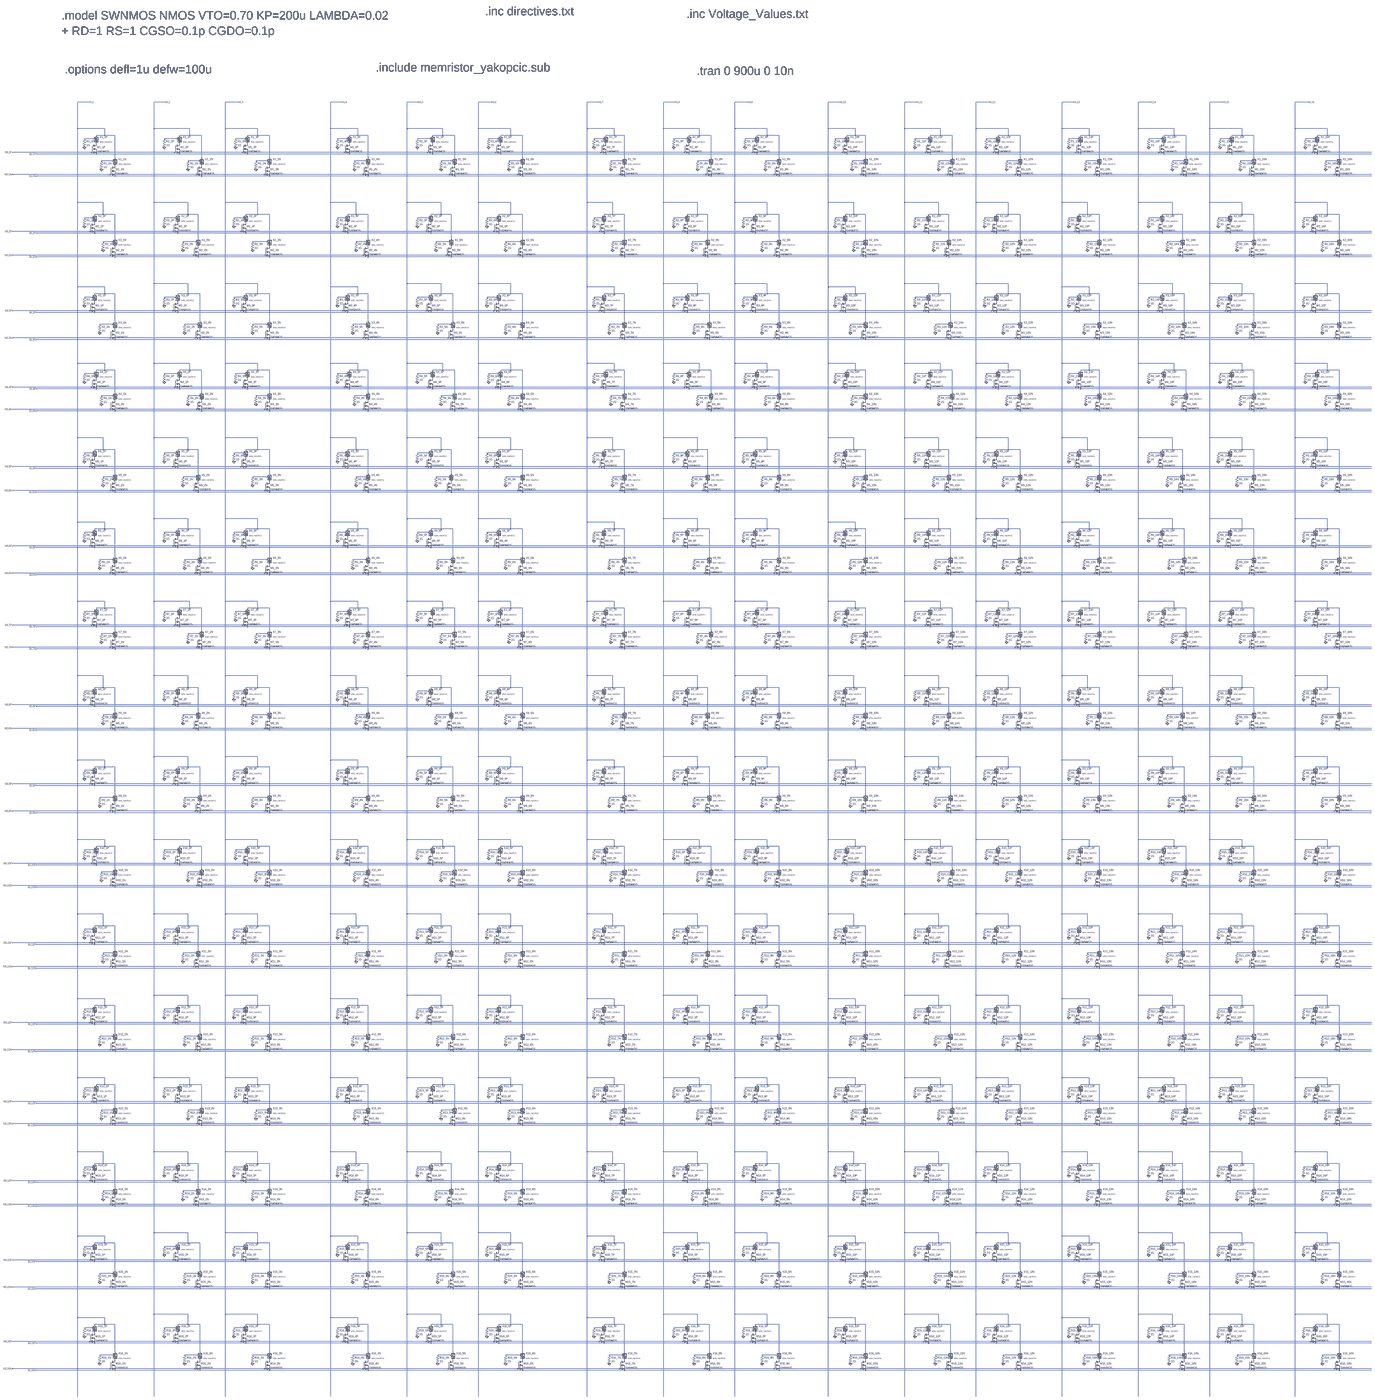
[diagram p0: schematic Trenery-2T2R.asc, whole sheet]
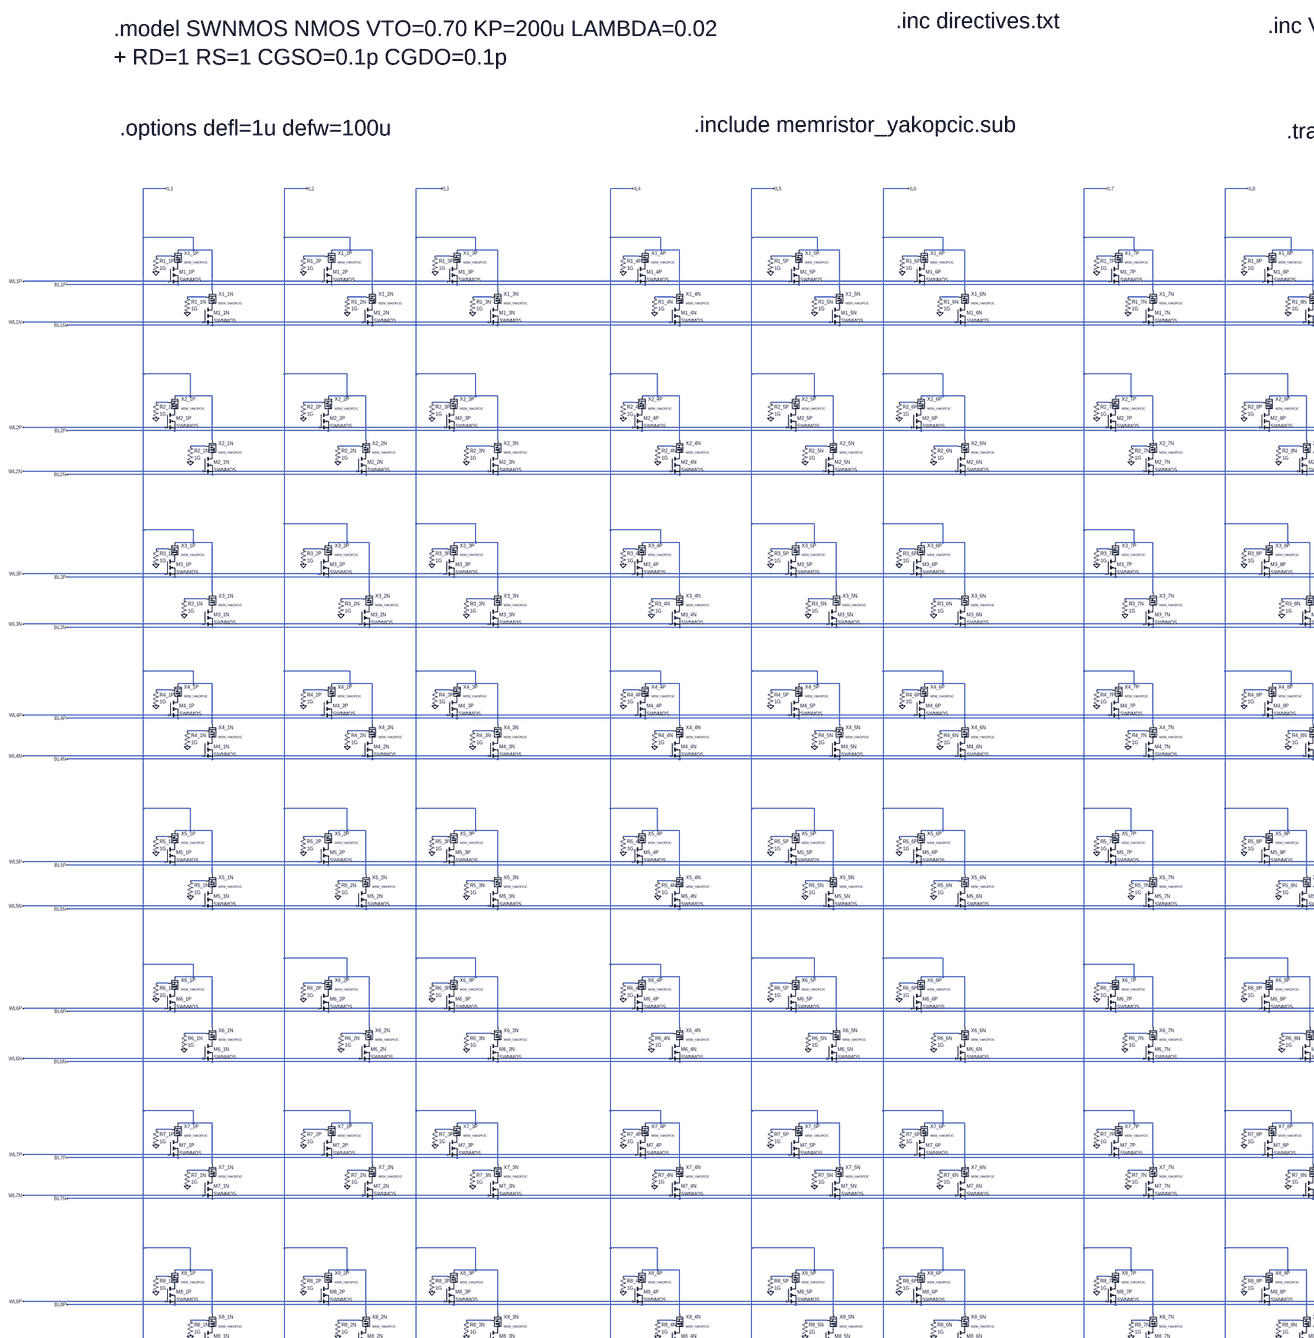
[diagram p1: schematic Trenery-2T2R.asc, part, row 1 of 2, column 1 of 2]
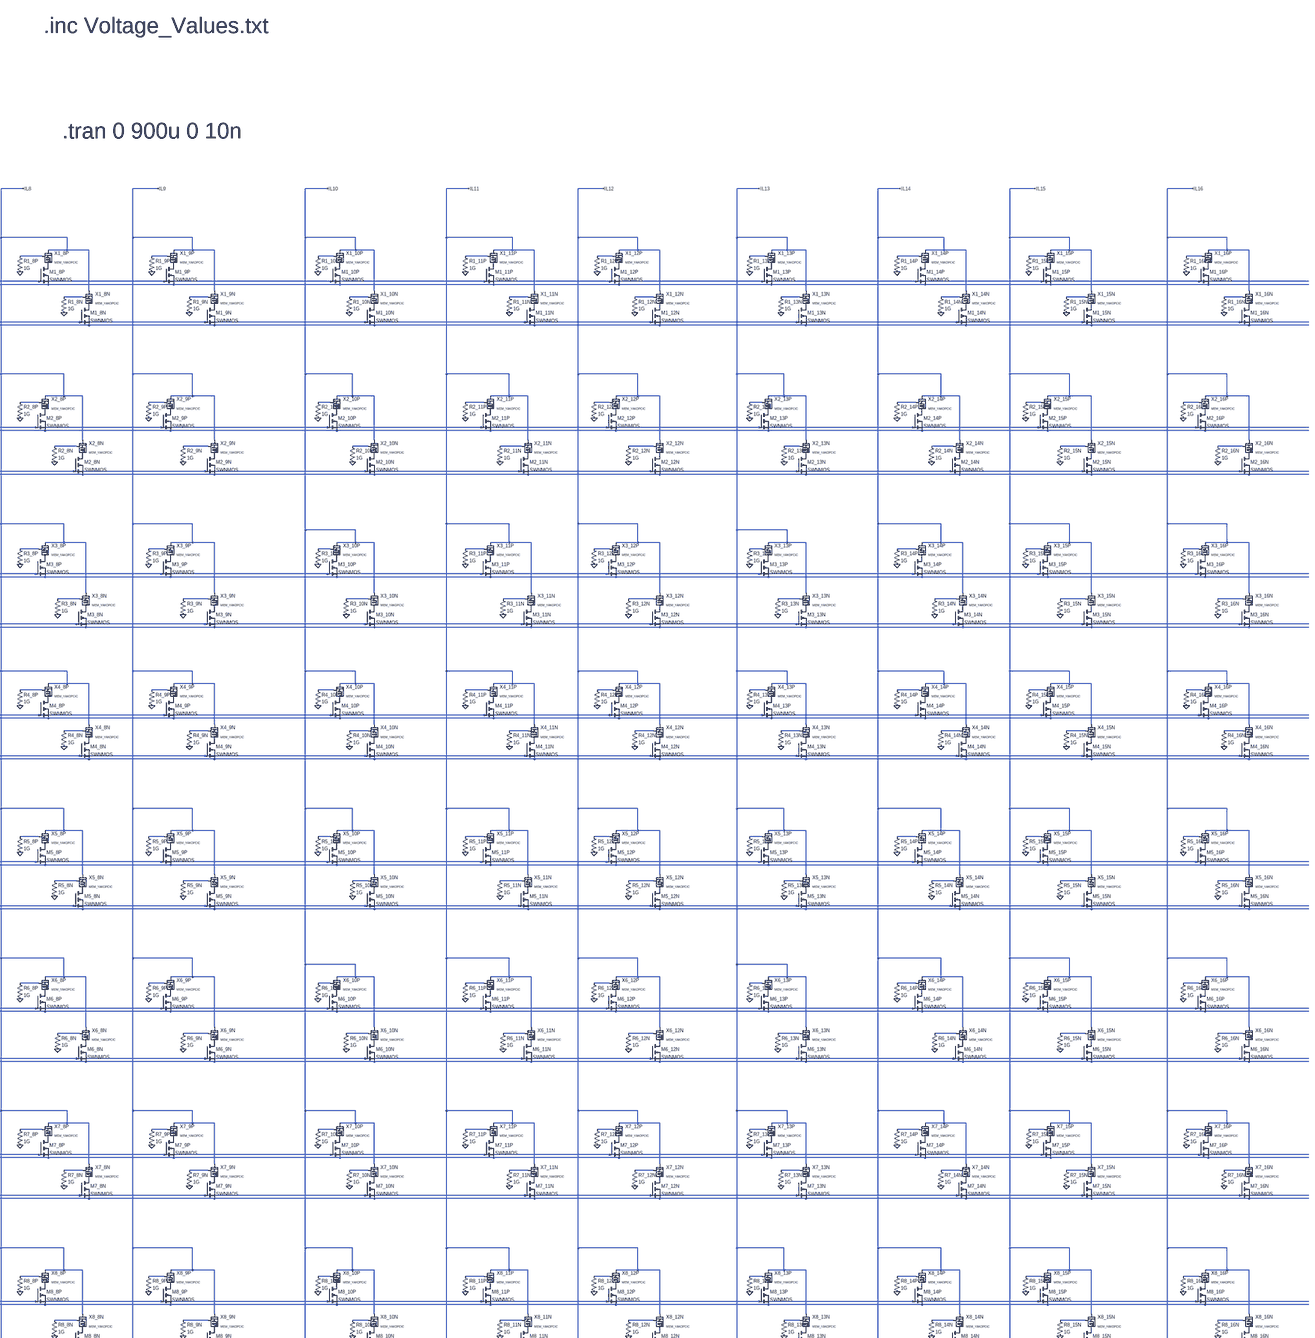
[diagram p2: schematic Trenery-2T2R.asc, part, row 1 of 2, column 2 of 2]
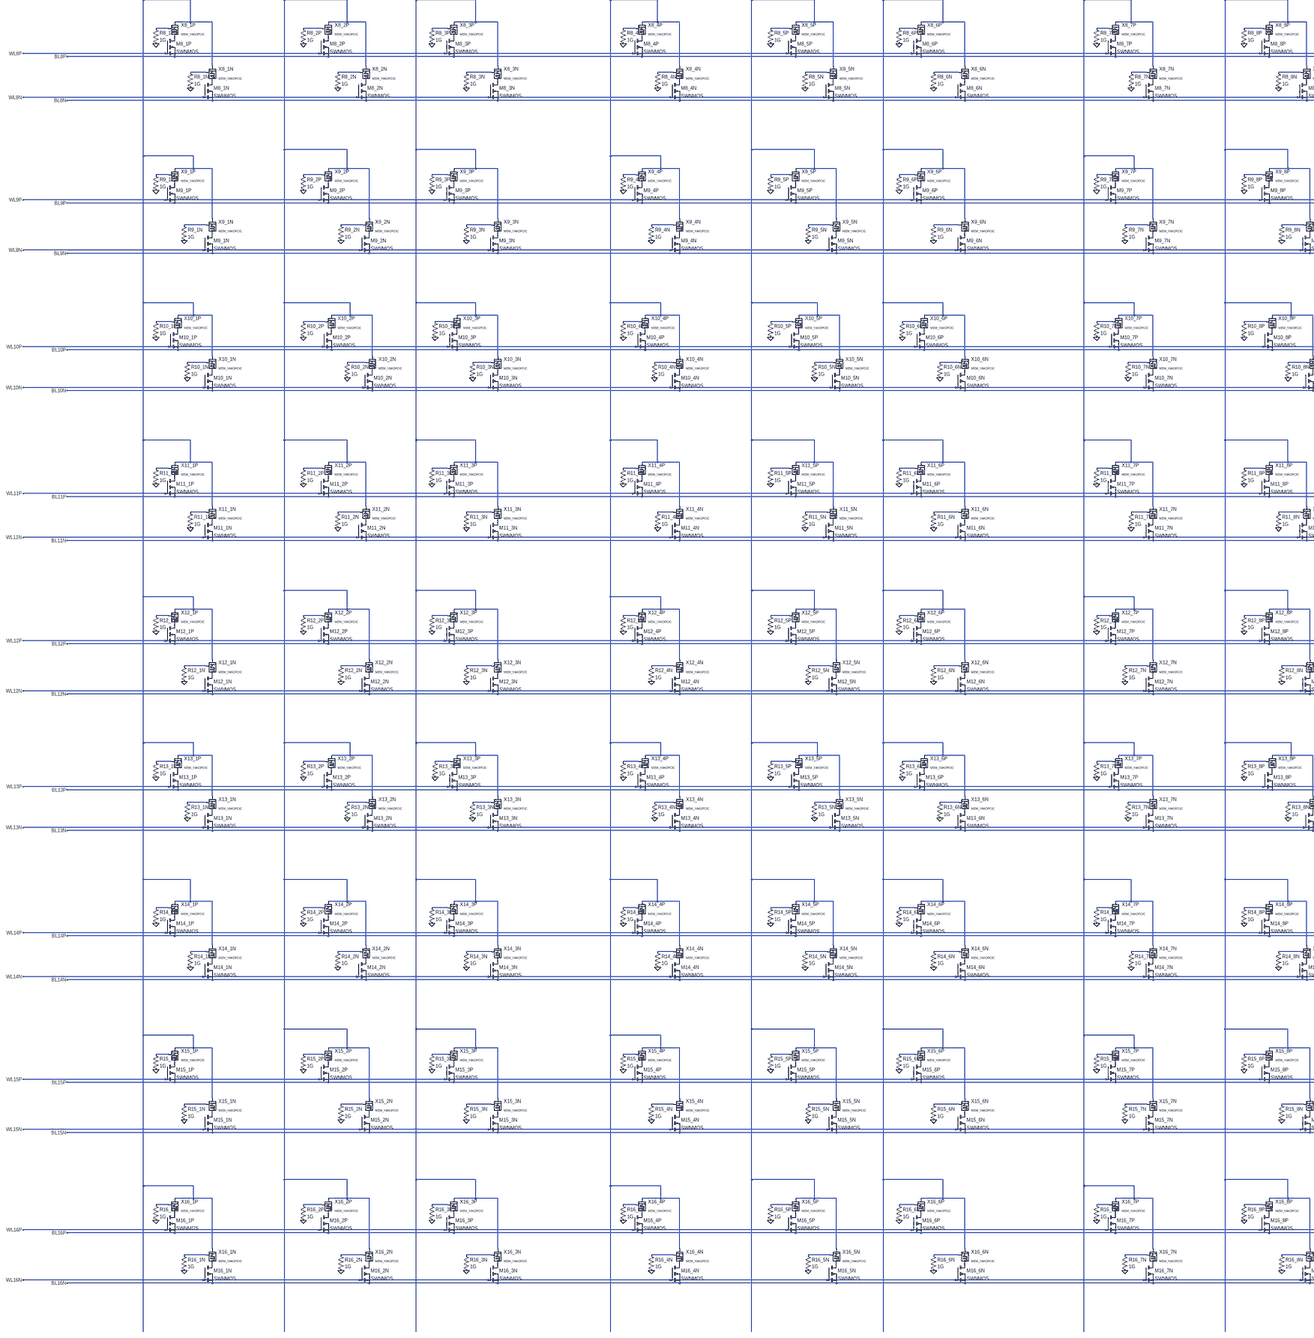
[diagram p3: schematic Trenery-2T2R.asc, part, row 2 of 2, column 1 of 2]
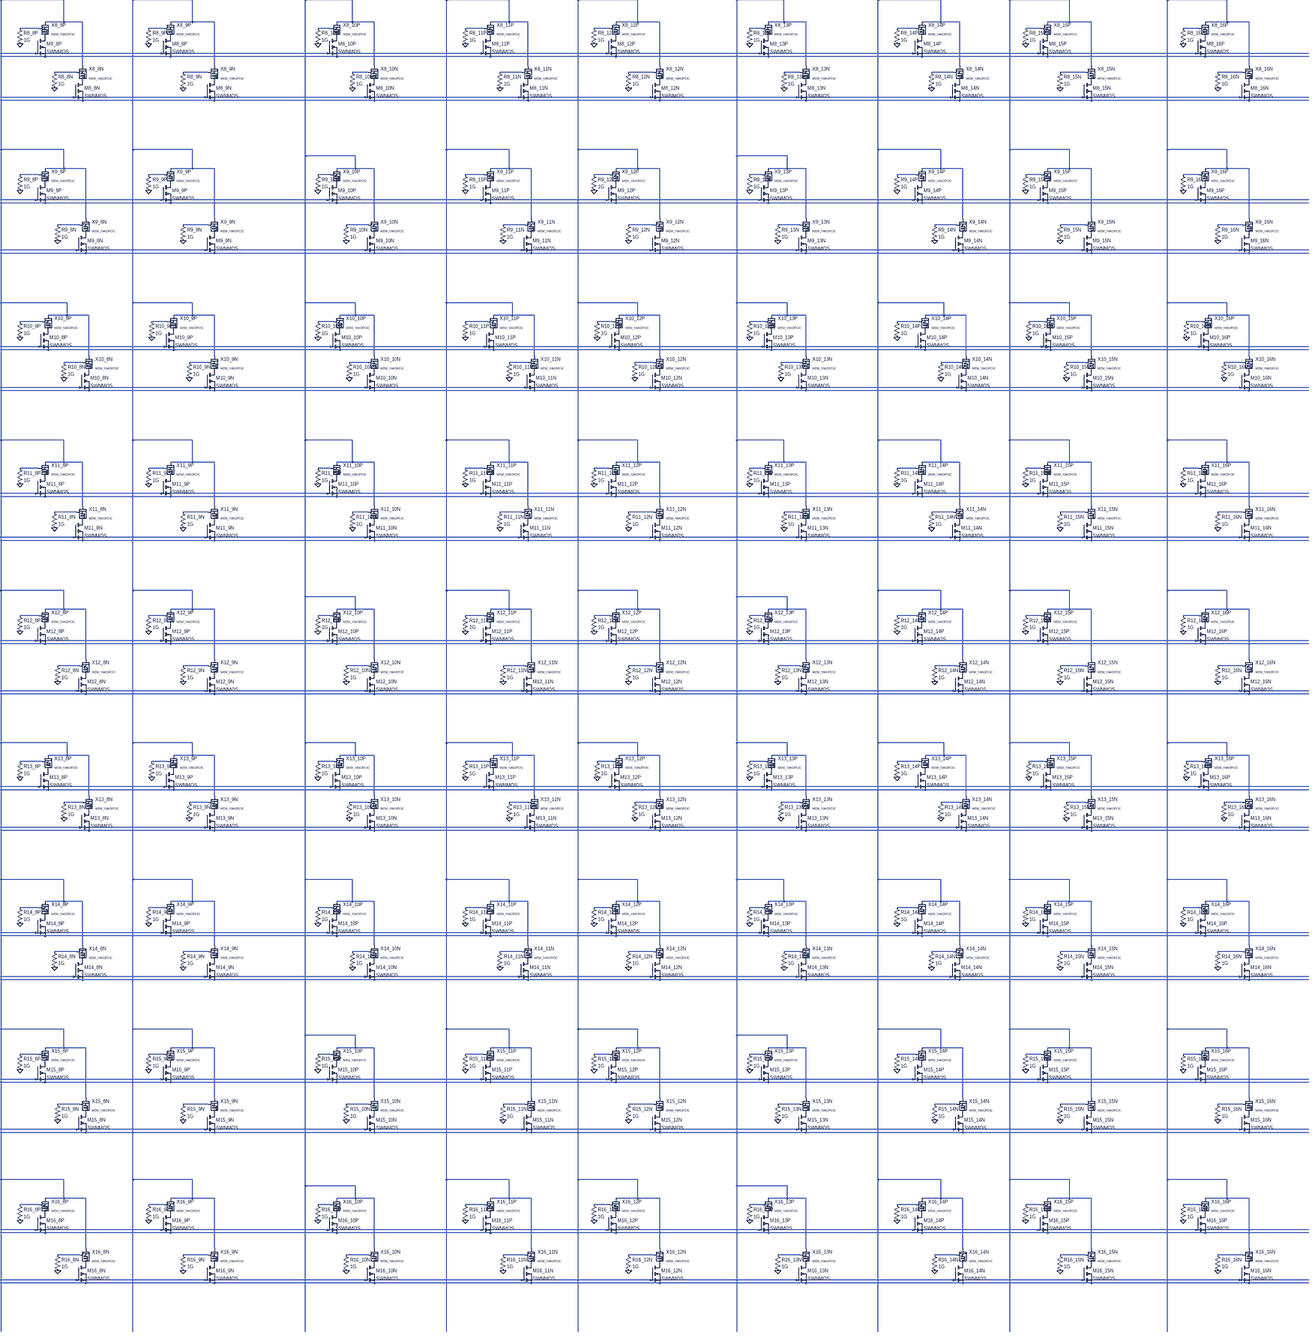
[diagram p4: schematic Trenery-2T2R.asc, part, row 2 of 2, column 2 of 2]
* Trenery-2T2R.asc
M1_1P P001 WL1P BL1P BL1P SWNMOS
M1_1N P002 WL1N BL1N BL1N SWNMOS
M1_2N P003 WL1N BL1N BL1N SWNMOS
M1_3N P004 WL1N BL1N BL1N SWNMOS
M2_1P P005 WL2P BL2P BL2P SWNMOS
M1_2P P006 WL1P BL1P BL1P SWNMOS
M2_1N P007 WL2N BL2N BL2N SWNMOS
M2_2P P008 WL2P BL2P BL2P SWNMOS
M2_2N P009 WL2N BL2N BL2N SWNMOS
M2_3P P010 WL2P BL2P BL2P SWNMOS
M2_3N P011 WL2N BL2N BL2N SWNMOS
M1_3P P012 WL1P BL1P BL1P SWNMOS
M3_1P P013 WL3P BL3P BL3P SWNMOS
M3_1N P014 WL3N BL3N BL3N SWNMOS
M3_2P P015 WL3P BL3P BL3P SWNMOS
M3_2N P016 WL3N BL3N BL3N SWNMOS
M3_3P P017 WL3P BL3P BL3P SWNMOS
M3_3N P018 WL3N BL3N BL3N SWNMOS
X§X2_1P IL1 P005 N033 MEM_YAKOPCIC  ; pins TE BE XSV
X§X2_1N IL1 P007 N049 MEM_YAKOPCIC  ; pins TE BE XSV
X§X2_2P IL2 P008 N034 MEM_YAKOPCIC  ; pins TE BE XSV
X§X2_2N IL2 P009 N050 MEM_YAKOPCIC  ; pins TE BE XSV
X§X2_3P IL3 P010 N035 MEM_YAKOPCIC  ; pins TE BE XSV
X§X2_3N IL3 P011 N051 MEM_YAKOPCIC  ; pins TE BE XSV
X§X1_1P IL1 P001 N001 MEM_YAKOPCIC  ; pins TE BE XSV
X§X1_1N IL1 P002 N017 MEM_YAKOPCIC  ; pins TE BE XSV
X§X1_2P IL2 P006 N002 MEM_YAKOPCIC  ; pins TE BE XSV
X§X1_2N IL2 P003 N018 MEM_YAKOPCIC  ; pins TE BE XSV
X§X1_3P IL3 P012 N003 MEM_YAKOPCIC  ; pins TE BE XSV
X§X1_3N IL3 P004 N019 MEM_YAKOPCIC  ; pins TE BE XSV
X§X3_1P IL1 P013 N065 MEM_YAKOPCIC  ; pins TE BE XSV
X§X3_1N IL1 P014 N081 MEM_YAKOPCIC  ; pins TE BE XSV
X§X3_2P IL2 P015 N066 MEM_YAKOPCIC  ; pins TE BE XSV
X§X3_2N IL2 P016 N082 MEM_YAKOPCIC  ; pins TE BE XSV
X§X3_3P IL3 P017 N067 MEM_YAKOPCIC  ; pins TE BE XSV
X§X3_3N IL3 P018 N083 MEM_YAKOPCIC  ; pins TE BE XSV
R2_1P N033 0 1G
R2_2P N034 0 1G
R2_3P N035 0 1G
R3_1P N065 0 1G
R3_2P N066 0 1G
R3_3P N067 0 1G
R3_3N N083 0 1G
R3_2N N082 0 1G
R3_1N N081 0 1G
R1_1P N001 0 1G tol=1 pwr=0.1
R1_2P N002 0 1G
R1_3P N003 0 1G
R1_1N N017 0 1G
R1_2N N018 0 1G
R1_3N N019 0 1G
R2_2N N050 0 1G
R2_3N N051 0 1G
R2_1N N049 0 1G
M1_4P P019 WL1P BL1P BL1P SWNMOS
M1_4N P020 WL1N BL1N BL1N SWNMOS
M1_5N P021 WL1N BL1N BL1N SWNMOS
M1_6N P022 WL1N BL1N BL1N SWNMOS
M2_4P P023 WL2P BL2P BL2P SWNMOS
M1_5P P024 WL1P BL1P BL1P SWNMOS
M2_4N P025 WL2N BL2N BL2N SWNMOS
M2_5P P026 WL2P BL2P BL2P SWNMOS
M2_5N P027 WL2N BL2N BL2N SWNMOS
M2_6P P028 WL2P BL2P BL2P SWNMOS
M2_6N P029 WL2N BL2N BL2N SWNMOS
M1_6P P030 WL1P BL1P BL1P SWNMOS
M3_4P P031 WL3P BL3P BL3P SWNMOS
M3_4N P032 WL3N BL3N BL3N SWNMOS
M3_5P P033 WL3P BL3P BL3P SWNMOS
M3_5N P034 WL3N BL3N BL3N SWNMOS
M3_6P P035 WL3P BL3P BL3P SWNMOS
M3_6N P036 WL3N BL3N BL3N SWNMOS
X§X2_4P IL4 P023 N036 MEM_YAKOPCIC  ; pins TE BE XSV
X§X2_4N IL4 P025 N052 MEM_YAKOPCIC  ; pins TE BE XSV
X§X2_5P IL5 P026 N037 MEM_YAKOPCIC  ; pins TE BE XSV
X§X2_5N IL5 P027 N053 MEM_YAKOPCIC  ; pins TE BE XSV
X§X2_6P IL6 P028 N038 MEM_YAKOPCIC  ; pins TE BE XSV
X§X2_6N IL6 P029 N054 MEM_YAKOPCIC  ; pins TE BE XSV
X§X1_4P IL4 P019 N004 MEM_YAKOPCIC  ; pins TE BE XSV
X§X1_4N IL4 P020 N020 MEM_YAKOPCIC  ; pins TE BE XSV
X§X1_5P IL5 P024 N005 MEM_YAKOPCIC  ; pins TE BE XSV
X§X1_5N IL5 P021 N021 MEM_YAKOPCIC  ; pins TE BE XSV
X§X1_6P IL6 P030 N006 MEM_YAKOPCIC  ; pins TE BE XSV
X§X1_6N IL6 P022 N022 MEM_YAKOPCIC  ; pins TE BE XSV
X§X3_4P IL4 P031 N068 MEM_YAKOPCIC  ; pins TE BE XSV
X§X3_4N IL4 P032 N084 MEM_YAKOPCIC  ; pins TE BE XSV
X§X3_5P IL5 P033 N069 MEM_YAKOPCIC  ; pins TE BE XSV
X§X3_5N IL5 P034 N085 MEM_YAKOPCIC  ; pins TE BE XSV
X§X3_6P IL6 P035 N070 MEM_YAKOPCIC  ; pins TE BE XSV
X§X3_6N IL6 P036 N086 MEM_YAKOPCIC  ; pins TE BE XSV
R2_4P N036 0 1G
R2_5P N037 0 1G
R2_6P N038 0 1G
R3_4P N068 0 1G
R3_5P N069 0 1G
R3_6P N070 0 1G
R3_6N N086 0 1G
R3_5N N085 0 1G
R3_4N N084 0 1G
R1_4P N004 0 1G tol=1 pwr=0.1
R1_5P N005 0 1G
R1_6P N006 0 1G
R1_4N N020 0 1G
R1_5N N021 0 1G
R1_6N N022 0 1G
R2_5N N053 0 1G
R2_6N N054 0 1G
R2_4N N052 0 1G
M1_7P P037 WL1P BL1P BL1P SWNMOS
M1_7N P038 WL1N BL1N BL1N SWNMOS
M1_8N P039 WL1N BL1N BL1N SWNMOS
M1_9N P040 WL1N BL1N BL1N SWNMOS
M2_7P P041 WL2P BL2P BL2P SWNMOS
M1_8P P042 WL1P BL1P BL1P SWNMOS
M2_7N P043 WL2N BL2N BL2N SWNMOS
M2_8P P044 WL2P BL2P BL2P SWNMOS
M2_8N P045 WL2N BL2N BL2N SWNMOS
M2_9P P046 WL2P BL2P BL2P SWNMOS
M2_9N P047 WL2N BL2N BL2N SWNMOS
M1_9P P048 WL1P BL1P BL1P SWNMOS
M3_7P P049 WL3P BL3P BL3P SWNMOS
M3_7N P050 WL3N BL3N BL3N SWNMOS
M3_8P P051 WL3P BL3P BL3P SWNMOS
M3_8N P052 WL3N BL3N BL3N SWNMOS
M3_9P P053 WL3P BL3P BL3P SWNMOS
M3_9N P054 WL3N BL3N BL3N SWNMOS
X§X2_7P IL7 P041 N039 MEM_YAKOPCIC  ; pins TE BE XSV
X§X2_7N IL7 P043 N055 MEM_YAKOPCIC  ; pins TE BE XSV
X§X2_8P IL8 P044 N040 MEM_YAKOPCIC  ; pins TE BE XSV
X§X2_8N IL8 P045 N056 MEM_YAKOPCIC  ; pins TE BE XSV
X§X2_9P IL9 P046 N041 MEM_YAKOPCIC  ; pins TE BE XSV
X§X2_9N IL9 P047 N057 MEM_YAKOPCIC  ; pins TE BE XSV
X§X1_7P IL7 P037 N007 MEM_YAKOPCIC  ; pins TE BE XSV
X§X1_7N IL7 P038 N023 MEM_YAKOPCIC  ; pins TE BE XSV
X§X1_8P IL8 P042 N008 MEM_YAKOPCIC  ; pins TE BE XSV
X§X1_8N IL8 P039 N024 MEM_YAKOPCIC  ; pins TE BE XSV
X§X1_9P IL9 P048 N009 MEM_YAKOPCIC  ; pins TE BE XSV
X§X1_9N IL9 P040 N025 MEM_YAKOPCIC  ; pins TE BE XSV
X§X3_7P IL7 P049 N071 MEM_YAKOPCIC  ; pins TE BE XSV
X§X3_7N IL7 P050 N087 MEM_YAKOPCIC  ; pins TE BE XSV
X§X3_8P IL8 P051 N072 MEM_YAKOPCIC  ; pins TE BE XSV
X§X3_8N IL8 P052 N088 MEM_YAKOPCIC  ; pins TE BE XSV
X§X3_9P IL9 P053 N073 MEM_YAKOPCIC  ; pins TE BE XSV
X§X3_9N IL9 P054 N089 MEM_YAKOPCIC  ; pins TE BE XSV
R2_7P N039 0 1G
R2_8P N040 0 1G
R2_9P N041 0 1G
R3_7P N071 0 1G
R3_8P N072 0 1G
R3_9P N073 0 1G
R3_9N N089 0 1G
R3_8N N088 0 1G
R3_7N N087 0 1G
R1_7P N007 0 1G tol=1 pwr=0.1
R1_8P N008 0 1G
R1_9P N009 0 1G
R1_7N N023 0 1G
R1_8N N024 0 1G
R1_9N N025 0 1G
R2_8N N056 0 1G
R2_9N N057 0 1G
R2_7N N055 0 1G
M1_10P P055 WL1P BL1P BL1P SWNMOS
M1_10N P056 WL1N BL1N BL1N SWNMOS
M1_11N P057 WL1N BL1N BL1N SWNMOS
M1_12N P058 WL1N BL1N BL1N SWNMOS
M2_10P P059 WL2P BL2P BL2P SWNMOS
M1_11P P060 WL1P BL1P BL1P SWNMOS
M2_10N P061 WL2N BL2N BL2N SWNMOS
M2_11P P062 WL2P BL2P BL2P SWNMOS
M2_11N P063 WL2N BL2N BL2N SWNMOS
M2_12P P064 WL2P BL2P BL2P SWNMOS
M2_12N P065 WL2N BL2N BL2N SWNMOS
M1_12P P066 WL1P BL1P BL1P SWNMOS
M3_10P P067 WL3P BL3P BL3P SWNMOS
M3_10N P068 WL3N BL3N BL3N SWNMOS
M3_11P P069 WL3P BL3P BL3P SWNMOS
M3_11N P070 WL3N BL3N BL3N SWNMOS
M3_12P P071 WL3P BL3P BL3P SWNMOS
M3_12N P072 WL3N BL3N BL3N SWNMOS
X§X2_10P IL10 P059 N042 MEM_YAKOPCIC  ; pins TE BE XSV
X§X2_10N IL10 P061 N058 MEM_YAKOPCIC  ; pins TE BE XSV
X§X2_11P IL11 P062 N043 MEM_YAKOPCIC  ; pins TE BE XSV
X§X2_11N IL11 P063 N059 MEM_YAKOPCIC  ; pins TE BE XSV
X§X2_12P IL12 P064 N044 MEM_YAKOPCIC  ; pins TE BE XSV
X§X2_12N IL12 P065 N060 MEM_YAKOPCIC  ; pins TE BE XSV
X§X1_10P IL10 P055 N010 MEM_YAKOPCIC  ; pins TE BE XSV
X§X1_10N IL10 P056 N026 MEM_YAKOPCIC  ; pins TE BE XSV
X§X1_11P IL11 P060 N011 MEM_YAKOPCIC  ; pins TE BE XSV
X§X1_11N IL11 P057 N027 MEM_YAKOPCIC  ; pins TE BE XSV
X§X1_12P IL12 P066 N012 MEM_YAKOPCIC  ; pins TE BE XSV
X§X1_12N IL12 P058 N028 MEM_YAKOPCIC  ; pins TE BE XSV
X§X3_10P IL10 P067 N074 MEM_YAKOPCIC  ; pins TE BE XSV
X§X3_10N IL10 P068 N090 MEM_YAKOPCIC  ; pins TE BE XSV
X§X3_11P IL11 P069 N075 MEM_YAKOPCIC  ; pins TE BE XSV
X§X3_11N IL11 P070 N091 MEM_YAKOPCIC  ; pins TE BE XSV
X§X3_12P IL12 P071 N076 MEM_YAKOPCIC  ; pins TE BE XSV
X§X3_12N IL12 P072 N092 MEM_YAKOPCIC  ; pins TE BE XSV
R2_10P N042 0 1G
R2_11P N043 0 1G
R2_12P N044 0 1G
R3_10P N074 0 1G
R3_11P N075 0 1G
R3_12P N076 0 1G
R3_12N N092 0 1G
R3_11N N091 0 1G
R3_10N N090 0 1G
R1_10P N010 0 1G tol=1 pwr=0.1
R1_11P N011 0 1G
R1_12P N012 0 1G
R1_10N N026 0 1G
R1_11N N027 0 1G
R1_12N N028 0 1G
R2_11N N059 0 1G
R2_12N N060 0 1G
R2_10N N058 0 1G
M1_13P P073 WL1P BL1P BL1P SWNMOS
M1_13N P074 WL1N BL1N BL1N SWNMOS
M1_14N P075 WL1N BL1N BL1N SWNMOS
M1_15N P076 WL1N BL1N BL1N SWNMOS
M2_13P P077 WL2P BL2P BL2P SWNMOS
M1_14P P078 WL1P BL1P BL1P SWNMOS
M2_13N P079 WL2N BL2N BL2N SWNMOS
M2_14P P080 WL2P BL2P BL2P SWNMOS
M2_14N P081 WL2N BL2N BL2N SWNMOS
M2_15P P082 WL2P BL2P BL2P SWNMOS
M2_15N P083 WL2N BL2N BL2N SWNMOS
M1_15P P084 WL1P BL1P BL1P SWNMOS
M3_13P P085 WL3P BL3P BL3P SWNMOS
M3_13N P086 WL3N BL3N BL3N SWNMOS
M3_14P P087 WL3P BL3P BL3P SWNMOS
M3_14N P088 WL3N BL3N BL3N SWNMOS
M3_15P P089 WL3P BL3P BL3P SWNMOS
M3_15N P090 WL3N BL3N BL3N SWNMOS
X§X2_13P IL13 P077 N045 MEM_YAKOPCIC  ; pins TE BE XSV
X§X2_13N IL13 P079 N061 MEM_YAKOPCIC  ; pins TE BE XSV
X§X2_14P IL14 P080 N046 MEM_YAKOPCIC  ; pins TE BE XSV
X§X2_14N IL14 P081 N062 MEM_YAKOPCIC  ; pins TE BE XSV
X§X2_15P IL15 P082 N047 MEM_YAKOPCIC  ; pins TE BE XSV
X§X2_15N IL15 P083 N063 MEM_YAKOPCIC  ; pins TE BE XSV
X§X1_13P IL13 P073 N013 MEM_YAKOPCIC  ; pins TE BE XSV
X§X1_13N IL13 P074 N029 MEM_YAKOPCIC  ; pins TE BE XSV
X§X1_14P IL14 P078 N014 MEM_YAKOPCIC  ; pins TE BE XSV
X§X1_14N IL14 P075 N030 MEM_YAKOPCIC  ; pins TE BE XSV
X§X1_15P IL15 P084 N015 MEM_YAKOPCIC  ; pins TE BE XSV
X§X1_15N IL15 P076 N031 MEM_YAKOPCIC  ; pins TE BE XSV
X§X3_13P IL13 P085 N077 MEM_YAKOPCIC  ; pins TE BE XSV
X§X3_13N IL13 P086 N093 MEM_YAKOPCIC  ; pins TE BE XSV
X§X3_14P IL14 P087 N078 MEM_YAKOPCIC  ; pins TE BE XSV
X§X3_14N IL14 P088 N094 MEM_YAKOPCIC  ; pins TE BE XSV
X§X3_15P IL15 P089 N079 MEM_YAKOPCIC  ; pins TE BE XSV
X§X3_15N IL15 P090 N095 MEM_YAKOPCIC  ; pins TE BE XSV
R2_13P N045 0 1G
R2_14P N046 0 1G
R2_15P N047 0 1G
R3_13P N077 0 1G
R3_14P N078 0 1G
R3_15P N079 0 1G
R3_15N N095 0 1G
R3_14N N094 0 1G
R3_13N N093 0 1G
R1_13P N013 0 1G tol=1 pwr=0.1
R1_14P N014 0 1G
R1_15P N015 0 1G
R1_13N N029 0 1G
R1_14N N030 0 1G
R1_15N N031 0 1G
R2_14N N062 0 1G
R2_15N N063 0 1G
R2_13N N061 0 1G
M1_16N P091 WL1N BL1N BL1N SWNMOS
M2_16P P092 WL2P BL2P BL2P SWNMOS
M2_16N P093 WL2N BL2N BL2N SWNMOS
M1_16P P094 WL1P BL1P BL1P SWNMOS
M3_16P P095 WL3P BL3P BL3P SWNMOS
M3_16N P096 WL3N BL3N BL3N SWNMOS
X§X2_16P IL16 P092 N048 MEM_YAKOPCIC  ; pins TE BE XSV
X§X2_16N IL16 P093 N064 MEM_YAKOPCIC  ; pins TE BE XSV
X§X1_16P IL16 P094 N016 MEM_YAKOPCIC  ; pins TE BE XSV
X§X1_16N IL16 P091 N032 MEM_YAKOPCIC  ; pins TE BE XSV
X§X3_16P IL16 P095 N080 MEM_YAKOPCIC  ; pins TE BE XSV
X§X3_16N IL16 P096 N096 MEM_YAKOPCIC  ; pins TE BE XSV
R2_16P N048 0 1G
R3_16P N080 0 1G
R3_16N N096 0 1G
R1_16P N016 0 1G
R1_16N N032 0 1G
R2_16N N064 0 1G
M4_1P P097 WL4P BL4P BL4P SWNMOS
M4_1N P098 WL4N BL4N BL4N SWNMOS
M4_2N P099 WL4N BL4N BL4N SWNMOS
M4_3N P100 WL4N BL4N BL4N SWNMOS
M5_1P P101 WL5P BL5P BL5P SWNMOS
M4_2P P102 WL4P BL4P BL4P SWNMOS
M5_1N P103 WL5N BL5N BL5N SWNMOS
M5_2P P104 WL5P BL5P BL5P SWNMOS
M5_2N P105 WL5N BL5N BL5N SWNMOS
M5_3P P106 WL5P BL5P BL5P SWNMOS
M5_3N P107 WL5N BL5N BL5N SWNMOS
M4_3P P108 WL4P BL4P BL4P SWNMOS
M6_1P P109 WL6P BL6P BL6P SWNMOS
M6_1N P110 WL6N BL6N BL6N SWNMOS
M6_2P P111 WL6P BL6P BL6P SWNMOS
M6_2N P112 WL6N BL6N BL6N SWNMOS
M6_3P P113 WL6P BL6P BL6P SWNMOS
M6_3N P114 WL6N BL6N BL6N SWNMOS
X§X5_1P IL1 P101 N129 MEM_YAKOPCIC  ; pins TE BE XSV
X§X5_1N IL1 P103 N145 MEM_YAKOPCIC  ; pins TE BE XSV
X§X5_2P IL2 P104 N130 MEM_YAKOPCIC  ; pins TE BE XSV
X§X5_2N IL2 P105 N146 MEM_YAKOPCIC  ; pins TE BE XSV
X§X5_3P IL3 P106 N131 MEM_YAKOPCIC  ; pins TE BE XSV
X§X5_3N IL3 P107 N147 MEM_YAKOPCIC  ; pins TE BE XSV
X§X4_1P IL1 P097 N097 MEM_YAKOPCIC  ; pins TE BE XSV
X§X4_1N IL1 P098 N113 MEM_YAKOPCIC  ; pins TE BE XSV
X§X4_2P IL2 P102 N098 MEM_YAKOPCIC  ; pins TE BE XSV
X§X4_2N IL2 P099 N114 MEM_YAKOPCIC  ; pins TE BE XSV
X§X4_3P IL3 P108 N099 MEM_YAKOPCIC  ; pins TE BE XSV
X§X4_3N IL3 P100 N115 MEM_YAKOPCIC  ; pins TE BE XSV
X§X6_1P IL1 P109 N161 MEM_YAKOPCIC  ; pins TE BE XSV
X§X6_1N IL1 P110 N177 MEM_YAKOPCIC  ; pins TE BE XSV
X§X6_2P IL2 P111 N162 MEM_YAKOPCIC  ; pins TE BE XSV
X§X6_2N IL2 P112 N178 MEM_YAKOPCIC  ; pins TE BE XSV
X§X6_3P IL3 P113 N163 MEM_YAKOPCIC  ; pins TE BE XSV
X§X6_3N IL3 P114 N179 MEM_YAKOPCIC  ; pins TE BE XSV
R5_1P N129 0 1G
R5_2P N130 0 1G
R5_3P N131 0 1G
R6_1P N161 0 1G
R6_2P N162 0 1G
R6_3P N163 0 1G
R6_3N N179 0 1G
R6_2N N178 0 1G
R6_1N N177 0 1G
R4_1P N097 0 1G tol=1 pwr=0.1
R4_2P N098 0 1G
R4_3P N099 0 1G
R4_1N N113 0 1G
R4_2N N114 0 1G
R4_3N N115 0 1G
R5_2N N146 0 1G
R5_3N N147 0 1G
R5_1N N145 0 1G
M4_4P P115 WL4P BL4P BL4P SWNMOS
M4_4N P116 WL4N BL4N BL4N SWNMOS
M4_5N P117 WL4N BL4N BL4N SWNMOS
M4_6N P118 WL4N BL4N BL4N SWNMOS
M5_4P P119 WL5P BL5P BL5P SWNMOS
M4_5P P120 WL4P BL4P BL4P SWNMOS
M5_4N P121 WL5N BL5N BL5N SWNMOS
M5_5P P122 WL5P BL5P BL5P SWNMOS
M5_5N P123 WL5N BL5N BL5N SWNMOS
M5_6P P124 WL5P BL5P BL5P SWNMOS
M5_6N P125 WL5N BL5N BL5N SWNMOS
M4_6P P126 WL4P BL4P BL4P SWNMOS
M6_4P P127 WL6P BL6P BL6P SWNMOS
M6_4N P128 WL6N BL6N BL6N SWNMOS
M6_5P P129 WL6P BL6P BL6P SWNMOS
M6_5N P130 WL6N BL6N BL6N SWNMOS
M6_6P P131 WL6P BL6P BL6P SWNMOS
M6_6N P132 WL6N BL6N BL6N SWNMOS
X§X5_4P IL4 P119 N132 MEM_YAKOPCIC  ; pins TE BE XSV
X§X5_4N IL4 P121 N148 MEM_YAKOPCIC  ; pins TE BE XSV
X§X5_5P IL5 P122 N133 MEM_YAKOPCIC  ; pins TE BE XSV
X§X5_5N IL5 P123 N149 MEM_YAKOPCIC  ; pins TE BE XSV
X§X5_6P IL6 P124 N134 MEM_YAKOPCIC  ; pins TE BE XSV
X§X5_6N IL6 P125 N150 MEM_YAKOPCIC  ; pins TE BE XSV
X§X4_4P IL4 P115 N100 MEM_YAKOPCIC  ; pins TE BE XSV
X§X4_4N IL4 P116 N116 MEM_YAKOPCIC  ; pins TE BE XSV
X§X4_5P IL5 P120 N101 MEM_YAKOPCIC  ; pins TE BE XSV
X§X4_5N IL5 P117 N117 MEM_YAKOPCIC  ; pins TE BE XSV
X§X4_6P IL6 P126 N102 MEM_YAKOPCIC  ; pins TE BE XSV
X§X4_6N IL6 P118 N118 MEM_YAKOPCIC  ; pins TE BE XSV
X§X6_4P IL4 P127 N164 MEM_YAKOPCIC  ; pins TE BE XSV
X§X6_4N IL4 P128 N180 MEM_YAKOPCIC  ; pins TE BE XSV
X§X6_5P IL5 P129 N165 MEM_YAKOPCIC  ; pins TE BE XSV
X§X6_5N IL5 P130 N181 MEM_YAKOPCIC  ; pins TE BE XSV
X§X6_6P IL6 P131 N166 MEM_YAKOPCIC  ; pins TE BE XSV
X§X6_6N IL6 P132 N182 MEM_YAKOPCIC  ; pins TE BE XSV
R5_4P N132 0 1G
R5_5P N133 0 1G
R5_6P N134 0 1G
R6_4P N164 0 1G
R6_5P N165 0 1G
R6_6P N166 0 1G
R6_6N N182 0 1G
R6_5N N181 0 1G
R6_4N N180 0 1G
R4_4P N100 0 1G tol=1 pwr=0.1
R4_5P N101 0 1G
R4_6P N102 0 1G
R4_4N N116 0 1G
R4_5N N117 0 1G
R4_6N N118 0 1G
R5_5N N149 0 1G
R5_6N N150 0 1G
R5_4N N148 0 1G
M4_7P P133 WL4P BL4P BL4P SWNMOS
M4_7N P134 WL4N BL4N BL4N SWNMOS
M4_8N P135 WL4N BL4N BL4N SWNMOS
M4_9N P136 WL4N BL4N BL4N SWNMOS
M5_7P P137 WL5P BL5P BL5P SWNMOS
M4_8P P138 WL4P BL4P BL4P SWNMOS
M5_7N P139 WL5N BL5N BL5N SWNMOS
M5_8P P140 WL5P BL5P BL5P SWNMOS
M5_8N P141 WL5N BL5N BL5N SWNMOS
M5_9P P142 WL5P BL5P BL5P SWNMOS
M5_9N P143 WL5N BL5N BL5N SWNMOS
M4_9P P144 WL4P BL4P BL4P SWNMOS
M6_7P P145 WL6P BL6P BL6P SWNMOS
M6_7N P146 WL6N BL6N BL6N SWNMOS
M6_8P P147 WL6P BL6P BL6P SWNMOS
M6_8N P148 WL6N BL6N BL6N SWNMOS
M6_9P P149 WL6P BL6P BL6P SWNMOS
M6_9N P150 WL6N BL6N BL6N SWNMOS
X§X5_7P IL7 P137 N135 MEM_YAKOPCIC  ; pins TE BE XSV
X§X5_7N IL7 P139 N151 MEM_YAKOPCIC  ; pins TE BE XSV
X§X5_8P IL8 P140 N136 MEM_YAKOPCIC  ; pins TE BE XSV
X§X5_8N IL8 P141 N152 MEM_YAKOPCIC  ; pins TE BE XSV
X§X5_9P IL9 P142 N137 MEM_YAKOPCIC  ; pins TE BE XSV
X§X5_9N IL9 P143 N153 MEM_YAKOPCIC  ; pins TE BE XSV
X§X4_7P IL7 P133 N103 MEM_YAKOPCIC  ; pins TE BE XSV
X§X4_7N IL7 P134 N119 MEM_YAKOPCIC  ; pins TE BE XSV
X§X4_8P IL8 P138 N104 MEM_YAKOPCIC  ; pins TE BE XSV
X§X4_8N IL8 P135 N120 MEM_YAKOPCIC  ; pins TE BE XSV
X§X4_9P IL9 P144 N105 MEM_YAKOPCIC  ; pins TE BE XSV
X§X4_9N IL9 P136 N121 MEM_YAKOPCIC  ; pins TE BE XSV
X§X6_7P IL7 P145 N167 MEM_YAKOPCIC  ; pins TE BE XSV
X§X6_7N IL7 P146 N183 MEM_YAKOPCIC  ; pins TE BE XSV
X§X6_8P IL8 P147 N168 MEM_YAKOPCIC  ; pins TE BE XSV
X§X6_8N IL8 P148 N184 MEM_YAKOPCIC  ; pins TE BE XSV
X§X6_9P IL9 P149 N169 MEM_YAKOPCIC  ; pins TE BE XSV
X§X6_9N IL9 P150 N185 MEM_YAKOPCIC  ; pins TE BE XSV
R5_7P N135 0 1G
R5_8P N136 0 1G
R5_9P N137 0 1G
R6_7P N167 0 1G
R6_8P N168 0 1G
R6_9P N169 0 1G
R6_9N N185 0 1G
R6_8N N184 0 1G
R6_7N N183 0 1G
R4_7P N103 0 1G tol=1 pwr=0.1
R4_8P N104 0 1G
R4_9P N105 0 1G
R4_7N N119 0 1G
R4_8N N120 0 1G
R4_9N N121 0 1G
R5_8N N152 0 1G
R5_9N N153 0 1G
R5_7N N151 0 1G
M4_10P P151 WL4P BL4P BL4P SWNMOS
M4_10N P152 WL4N BL4N BL4N SWNMOS
M4_11N P153 WL4N BL4N BL4N SWNMOS
M4_12N P154 WL4N BL4N BL4N SWNMOS
M5_10P P155 WL5P BL5P BL5P SWNMOS
M4_11P P156 WL4P BL4P BL4P SWNMOS
M5_10N P157 WL5N BL5N BL5N SWNMOS
M5_11P P158 WL5P BL5P BL5P SWNMOS
M5_11N P159 WL5N BL5N BL5N SWNMOS
M5_12P P160 WL5P BL5P BL5P SWNMOS
M5_12N P161 WL5N BL5N BL5N SWNMOS
M4_12P P162 WL4P BL4P BL4P SWNMOS
M6_10P P163 WL6P BL6P BL6P SWNMOS
M6_10N P164 WL6N BL6N BL6N SWNMOS
M6_11P P165 WL6P BL6P BL6P SWNMOS
M6_11N P166 WL6N BL6N BL6N SWNMOS
M6_12P P167 WL6P BL6P BL6P SWNMOS
M6_12N P168 WL6N BL6N BL6N SWNMOS
X§X5_10P IL10 P155 N138 MEM_YAKOPCIC  ; pins TE BE XSV
X§X5_10N IL10 P157 N154 MEM_YAKOPCIC  ; pins TE BE XSV
X§X5_11P IL11 P158 N139 MEM_YAKOPCIC  ; pins TE BE XSV
X§X5_11N IL11 P159 N155 MEM_YAKOPCIC  ; pins TE BE XSV
X§X5_12P IL12 P160 N140 MEM_YAKOPCIC  ; pins TE BE XSV
X§X5_12N IL12 P161 N156 MEM_YAKOPCIC  ; pins TE BE XSV
X§X4_10P IL10 P151 N106 MEM_YAKOPCIC  ; pins TE BE XSV
X§X4_10N IL10 P152 N122 MEM_YAKOPCIC  ; pins TE BE XSV
X§X4_11P IL11 P156 N107 MEM_YAKOPCIC  ; pins TE BE XSV
X§X4_11N IL11 P153 N123 MEM_YAKOPCIC  ; pins TE BE XSV
X§X4_12P IL12 P162 N108 MEM_YAKOPCIC  ; pins TE BE XSV
X§X4_12N IL12 P154 N124 MEM_YAKOPCIC  ; pins TE BE XSV
X§X6_10P IL10 P163 N170 MEM_YAKOPCIC  ; pins TE BE XSV
X§X6_10N IL10 P164 N186 MEM_YAKOPCIC  ; pins TE BE XSV
X§X6_11P IL11 P165 N171 MEM_YAKOPCIC  ; pins TE BE XSV
X§X6_11N IL11 P166 N187 MEM_YAKOPCIC  ; pins TE BE XSV
X§X6_12P IL12 P167 N172 MEM_YAKOPCIC  ; pins TE BE XSV
X§X6_12N IL12 P168 N188 MEM_YAKOPCIC  ; pins TE BE XSV
R5_10P N138 0 1G
R5_11P N139 0 1G
R5_12P N140 0 1G
R6_10P N170 0 1G
R6_11P N171 0 1G
R6_12P N172 0 1G
R6_12N N188 0 1G
R6_11N N187 0 1G
R6_10N N186 0 1G
R4_10P N106 0 1G tol=1 pwr=0.1
R4_11P N107 0 1G
R4_12P N108 0 1G
R4_10N N122 0 1G
R4_11N N123 0 1G
R4_12N N124 0 1G
R5_11N N155 0 1G
R5_12N N156 0 1G
R5_10N N154 0 1G
M4_13P P169 WL4P BL4P BL4P SWNMOS
M4_13N P170 WL4N BL4N BL4N SWNMOS
M4_14N P171 WL4N BL4N BL4N SWNMOS
M4_15N P172 WL4N BL4N BL4N SWNMOS
M5_13P P173 WL5P BL5P BL5P SWNMOS
M4_14P P174 WL4P BL4P BL4P SWNMOS
M5_13N P175 WL5N BL5N BL5N SWNMOS
M5_14P P176 WL5P BL5P BL5P SWNMOS
M5_14N P177 WL5N BL5N BL5N SWNMOS
M5_15P P178 WL5P BL5P BL5P SWNMOS
M5_15N P179 WL5N BL5N BL5N SWNMOS
M4_15P P180 WL4P BL4P BL4P SWNMOS
M6_13P P181 WL6P BL6P BL6P SWNMOS
M6_13N P182 WL6N BL6N BL6N SWNMOS
M6_14P P183 WL6P BL6P BL6P SWNMOS
M6_14N P184 WL6N BL6N BL6N SWNMOS
M6_15P P185 WL6P BL6P BL6P SWNMOS
M6_15N P186 WL6N BL6N BL6N SWNMOS
X§X5_13P IL13 P173 N141 MEM_YAKOPCIC  ; pins TE BE XSV
X§X5_13N IL13 P175 N157 MEM_YAKOPCIC  ; pins TE BE XSV
X§X5_14P IL14 P176 N142 MEM_YAKOPCIC  ; pins TE BE XSV
X§X5_14N IL14 P177 N158 MEM_YAKOPCIC  ; pins TE BE XSV
X§X5_15P IL15 P178 N143 MEM_YAKOPCIC  ; pins TE BE XSV
X§X5_15N IL15 P179 N159 MEM_YAKOPCIC  ; pins TE BE XSV
X§X4_13P IL13 P169 N109 MEM_YAKOPCIC  ; pins TE BE XSV
X§X4_13N IL13 P170 N125 MEM_YAKOPCIC  ; pins TE BE XSV
X§X4_14P IL14 P174 N110 MEM_YAKOPCIC  ; pins TE BE XSV
X§X4_14N IL14 P171 N126 MEM_YAKOPCIC  ; pins TE BE XSV
X§X4_15P IL15 P180 N111 MEM_YAKOPCIC  ; pins TE BE XSV
X§X4_15N IL15 P172 N127 MEM_YAKOPCIC  ; pins TE BE XSV
X§X6_13P IL13 P181 N173 MEM_YAKOPCIC  ; pins TE BE XSV
X§X6_13N IL13 P182 N189 MEM_YAKOPCIC  ; pins TE BE XSV
X§X6_14P IL14 P183 N174 MEM_YAKOPCIC  ; pins TE BE XSV
X§X6_14N IL14 P184 N190 MEM_YAKOPCIC  ; pins TE BE XSV
X§X6_15P IL15 P185 N175 MEM_YAKOPCIC  ; pins TE BE XSV
X§X6_15N IL15 P186 N191 MEM_YAKOPCIC  ; pins TE BE XSV
R5_13P N141 0 1G
R5_14P N142 0 1G
R5_15P N143 0 1G
R6_13P N173 0 1G
R6_14P N174 0 1G
R6_15P N175 0 1G
R6_15N N191 0 1G
R6_14N N190 0 1G
R6_13N N189 0 1G
R4_13P N109 0 1G tol=1 pwr=0.1
R4_14P N110 0 1G
R4_15P N111 0 1G
R4_13N N125 0 1G
R4_14N N126 0 1G
R4_15N N127 0 1G
R5_14N N158 0 1G
R5_15N N159 0 1G
R5_13N N157 0 1G
M4_16N P187 WL4N BL4N BL4N SWNMOS
M5_16P P188 WL5P BL5P BL5P SWNMOS
M5_16N P189 WL5N BL5N BL5N SWNMOS
M4_16P P190 WL4P BL4P BL4P SWNMOS
M6_16P P191 WL6P BL6P BL6P SWNMOS
M6_16N P192 WL6N BL6N BL6N SWNMOS
X§X5_16P IL16 P188 N144 MEM_YAKOPCIC  ; pins TE BE XSV
X§X5_16N IL16 P189 N160 MEM_YAKOPCIC  ; pins TE BE XSV
X§X4_16P IL16 P190 N112 MEM_YAKOPCIC  ; pins TE BE XSV
X§X4_16N IL16 P187 N128 MEM_YAKOPCIC  ; pins TE BE XSV
X§X6_16P IL16 P191 N176 MEM_YAKOPCIC  ; pins TE BE XSV
X§X6_16N IL16 P192 N192 MEM_YAKOPCIC  ; pins TE BE XSV
R5_16P N144 0 1G
R6_16P N176 0 1G
R6_16N N192 0 1G
R4_16P N112 0 1G
R4_16N N128 0 1G
R5_16N N160 0 1G
M7_1P P193 WL7P BL7P BL7P SWNMOS
M7_1N P194 WL7N BL7N BL7N SWNMOS
M7_2N P195 WL7N BL7N BL7N SWNMOS
M7_3N P196 WL7N BL7N BL7N SWNMOS
M8_1P P197 WL8P BL8P BL8P SWNMOS
M7_2P P198 WL7P BL7P BL7P SWNMOS
M8_1N P199 WL8N BL8N BL8N SWNMOS
M8_2P P200 WL8P BL8P BL8P SWNMOS
M8_2N P201 WL8N BL8N BL8N SWNMOS
M8_3P P202 WL8P BL8P BL8P SWNMOS
M8_3N P203 WL8N BL8N BL8N SWNMOS
M7_3P P204 WL7P BL7P BL7P SWNMOS
M9_1P P205 WL9P BL9P BL9P SWNMOS
M9_1N P206 WL9N BL9N BL9N SWNMOS
M9_2P P207 WL9P BL9P BL9P SWNMOS
M9_2N P208 WL9N BL9N BL9N SWNMOS
M9_3P P209 WL9P BL9P BL9P SWNMOS
M9_3N P210 WL9N BL9N BL9N SWNMOS
X§X8_1P IL1 P197 N225 MEM_YAKOPCIC  ; pins TE BE XSV
X§X8_1N IL1 P199 N241 MEM_YAKOPCIC  ; pins TE BE XSV
X§X8_2P IL2 P200 N226 MEM_YAKOPCIC  ; pins TE BE XSV
X§X8_2N IL2 P201 N242 MEM_YAKOPCIC  ; pins TE BE XSV
X§X8_3P IL3 P202 N227 MEM_YAKOPCIC  ; pins TE BE XSV
X§X8_3N IL3 P203 N243 MEM_YAKOPCIC  ; pins TE BE XSV
X§X7_1P IL1 P193 N193 MEM_YAKOPCIC  ; pins TE BE XSV
X§X7_1N IL1 P194 N209 MEM_YAKOPCIC  ; pins TE BE XSV
X§X7_2P IL2 P198 N194 MEM_YAKOPCIC  ; pins TE BE XSV
X§X7_2N IL2 P195 N210 MEM_YAKOPCIC  ; pins TE BE XSV
X§X7_3P IL3 P204 N195 MEM_YAKOPCIC  ; pins TE BE XSV
X§X7_3N IL3 P196 N211 MEM_YAKOPCIC  ; pins TE BE XSV
X§X9_1P IL1 P205 N257 MEM_YAKOPCIC  ; pins TE BE XSV
X§X9_1N IL1 P206 N273 MEM_YAKOPCIC  ; pins TE BE XSV
X§X9_2P IL2 P207 N258 MEM_YAKOPCIC  ; pins TE BE XSV
X§X9_2N IL2 P208 N274 MEM_YAKOPCIC  ; pins TE BE XSV
X§X9_3P IL3 P209 N259 MEM_YAKOPCIC  ; pins TE BE XSV
X§X9_3N IL3 P210 N275 MEM_YAKOPCIC  ; pins TE BE XSV
R8_1P N225 0 1G
R8_2P N226 0 1G
R8_3P N227 0 1G
R9_1P N257 0 1G
R9_2P N258 0 1G
R9_3P N259 0 1G
R9_3N N275 0 1G
R9_2N N274 0 1G
R9_1N N273 0 1G
R7_1P N193 0 1G tol=1 pwr=0.1
R7_2P N194 0 1G
R7_3P N195 0 1G
R7_1N N209 0 1G
R7_2N N210 0 1G
R7_3N N211 0 1G
R8_2N N242 0 1G
R8_3N N243 0 1G
R8_1N N241 0 1G
M7_4P P211 WL7P BL7P BL7P SWNMOS
M7_4N P212 WL7N BL7N BL7N SWNMOS
M7_5N P213 WL7N BL7N BL7N SWNMOS
M7_6N P214 WL7N BL7N BL7N SWNMOS
M8_4P P215 WL8P BL8P BL8P SWNMOS
M7_5P P216 WL7P BL7P BL7P SWNMOS
M8_4N P217 WL8N BL8N BL8N SWNMOS
M8_5P P218 WL8P BL8P BL8P SWNMOS
M8_5N P219 WL8N BL8N BL8N SWNMOS
M8_6P P220 WL8P BL8P BL8P SWNMOS
M8_6N P221 WL8N BL8N BL8N SWNMOS
M7_6P P222 WL7P BL7P BL7P SWNMOS
M9_4P P223 WL9P BL9P BL9P SWNMOS
M9_4N P224 WL9N BL9N BL9N SWNMOS
M9_5P P225 WL9P BL9P BL9P SWNMOS
M9_5N P226 WL9N BL9N BL9N SWNMOS
M9_6P P227 WL9P BL9P BL9P SWNMOS
M9_6N P228 WL9N BL9N BL9N SWNMOS
X§X8_4P IL4 P215 N228 MEM_YAKOPCIC  ; pins TE BE XSV
X§X8_4N IL4 P217 N244 MEM_YAKOPCIC  ; pins TE BE XSV
X§X8_5P IL5 P218 N229 MEM_YAKOPCIC  ; pins TE BE XSV
X§X8_5N IL5 P219 N245 MEM_YAKOPCIC  ; pins TE BE XSV
X§X8_6P IL6 P220 N230 MEM_YAKOPCIC  ; pins TE BE XSV
X§X8_6N IL6 P221 N246 MEM_YAKOPCIC  ; pins TE BE XSV
X§X7_4P IL4 P211 N196 MEM_YAKOPCIC  ; pins TE BE XSV
X§X7_4N IL4 P212 N212 MEM_YAKOPCIC  ; pins TE BE XSV
X§X7_5P IL5 P216 N197 MEM_YAKOPCIC  ; pins TE BE XSV
X§X7_5N IL5 P213 N213 MEM_YAKOPCIC  ; pins TE BE XSV
X§X7_6P IL6 P222 N198 MEM_YAKOPCIC  ; pins TE BE XSV
X§X7_6N IL6 P214 N214 MEM_YAKOPCIC  ; pins TE BE XSV
X§X9_4P IL4 P223 N260 MEM_YAKOPCIC  ; pins TE BE XSV
X§X9_4N IL4 P224 N276 MEM_YAKOPCIC  ; pins TE BE XSV
X§X9_5P IL5 P225 N261 MEM_YAKOPCIC  ; pins TE BE XSV
X§X9_5N IL5 P226 N277 MEM_YAKOPCIC  ; pins TE BE XSV
X§X9_6P IL6 P227 N262 MEM_YAKOPCIC  ; pins TE BE XSV
X§X9_6N IL6 P228 N278 MEM_YAKOPCIC  ; pins TE BE XSV
R8_4P N228 0 1G
R8_5P N229 0 1G
R8_6P N230 0 1G
R9_4P N260 0 1G
R9_5P N261 0 1G
R9_6P N262 0 1G
R9_6N N278 0 1G
R9_5N N277 0 1G
R9_4N N276 0 1G
R7_4P N196 0 1G tol=1 pwr=0.1
R7_5P N197 0 1G
R7_6P N198 0 1G
R7_4N N212 0 1G
R7_5N N213 0 1G
R7_6N N214 0 1G
R8_5N N245 0 1G
R8_6N N246 0 1G
R8_4N N244 0 1G
M7_7P P229 WL7P BL7P BL7P SWNMOS
M7_7N P230 WL7N BL7N BL7N SWNMOS
M7_8N P231 WL7N BL7N BL7N SWNMOS
M7_9N P232 WL7N BL7N BL7N SWNMOS
M8_7P P233 WL8P BL8P BL8P SWNMOS
M7_8P P234 WL7P BL7P BL7P SWNMOS
M8_7N P235 WL8N BL8N BL8N SWNMOS
M8_8P P236 WL8P BL8P BL8P SWNMOS
M8_8N P237 WL8N BL8N BL8N SWNMOS
M8_9P P238 WL8P BL8P BL8P SWNMOS
M8_9N P239 WL8N BL8N BL8N SWNMOS
M7_9P P240 WL7P BL7P BL7P SWNMOS
M9_7P P241 WL9P BL9P BL9P SWNMOS
M9_7N P242 WL9N BL9N BL9N SWNMOS
M9_8P P243 WL9P BL9P BL9P SWNMOS
M9_8N P244 WL9N BL9N BL9N SWNMOS
M9_9P P245 WL9P BL9P BL9P SWNMOS
M9_9N P246 WL9N BL9N BL9N SWNMOS
X§X8_7P IL7 P233 N231 MEM_YAKOPCIC  ; pins TE BE XSV
X§X8_7N IL7 P235 N247 MEM_YAKOPCIC  ; pins TE BE XSV
X§X8_8P IL8 P236 N232 MEM_YAKOPCIC  ; pins TE BE XSV
X§X8_8N IL8 P237 N248 MEM_YAKOPCIC  ; pins TE BE XSV
X§X8_9P IL9 P238 N233 MEM_YAKOPCIC  ; pins TE BE XSV
X§X8_9N IL9 P239 N249 MEM_YAKOPCIC  ; pins TE BE XSV
X§X7_7P IL7 P229 N199 MEM_YAKOPCIC  ; pins TE BE XSV
X§X7_7N IL7 P230 N215 MEM_YAKOPCIC  ; pins TE BE XSV
X§X7_8P IL8 P234 N200 MEM_YAKOPCIC  ; pins TE BE XSV
X§X7_8N IL8 P231 N216 MEM_YAKOPCIC  ; pins TE BE XSV
X§X7_9P IL9 P240 N201 MEM_YAKOPCIC  ; pins TE BE XSV
X§X7_9N IL9 P232 N217 MEM_YAKOPCIC  ; pins TE BE XSV
X§X9_7P IL7 P241 N263 MEM_YAKOPCIC  ; pins TE BE XSV
X§X9_7N IL7 P242 N279 MEM_YAKOPCIC  ; pins TE BE XSV
X§X9_8P IL8 P243 N264 MEM_YAKOPCIC  ; pins TE BE XSV
X§X9_8N IL8 P244 N280 MEM_YAKOPCIC  ; pins TE BE XSV
X§X9_9P IL9 P245 N265 MEM_YAKOPCIC  ; pins TE BE XSV
X§X9_9N IL9 P246 N281 MEM_YAKOPCIC  ; pins TE BE XSV
R8_7P N231 0 1G
R8_8P N232 0 1G
R8_9P N233 0 1G
R9_7P N263 0 1G
R9_8P N264 0 1G
R9_9P N265 0 1G
R9_9N N281 0 1G
R9_8N N280 0 1G
R9_7N N279 0 1G
R7_7P N199 0 1G tol=1 pwr=0.1
R7_8P N200 0 1G
R7_9P N201 0 1G
R7_7N N215 0 1G
R7_8N N216 0 1G
R7_9N N217 0 1G
R8_8N N248 0 1G
R8_9N N249 0 1G
R8_7N N247 0 1G
M7_10P P247 WL7P BL7P BL7P SWNMOS
M7_10N P248 WL7N BL7N BL7N SWNMOS
M7_11N P249 WL7N BL7N BL7N SWNMOS
M7_12N P250 WL7N BL7N BL7N SWNMOS
M8_10P P251 WL8P BL8P BL8P SWNMOS
M7_11P P252 WL7P BL7P BL7P SWNMOS
M8_10N P253 WL8N BL8N BL8N SWNMOS
M8_11P P254 WL8P BL8P BL8P SWNMOS
M8_11N P255 WL8N BL8N BL8N SWNMOS
M8_12P P256 WL8P BL8P BL8P SWNMOS
M8_12N P257 WL8N BL8N BL8N SWNMOS
M7_12P P258 WL7P BL7P BL7P SWNMOS
M9_10P P259 WL9P BL9P BL9P SWNMOS
M9_10N P260 WL9N BL9N BL9N SWNMOS
M9_11P P261 WL9P BL9P BL9P SWNMOS
M9_11N P262 WL9N BL9N BL9N SWNMOS
M9_12P P263 WL9P BL9P BL9P SWNMOS
M9_12N P264 WL9N BL9N BL9N SWNMOS
X§X8_10P IL10 P251 N234 MEM_YAKOPCIC  ; pins TE BE XSV
X§X8_10N IL10 P253 N250 MEM_YAKOPCIC  ; pins TE BE XSV
X§X8_11P IL11 P254 N235 MEM_YAKOPCIC  ; pins TE BE XSV
X§X8_11N IL11 P255 N251 MEM_YAKOPCIC  ; pins TE BE XSV
X§X8_12P IL12 P256 N236 MEM_YAKOPCIC  ; pins TE BE XSV
X§X8_12N IL12 P257 N252 MEM_YAKOPCIC  ; pins TE BE XSV
X§X7_10P IL10 P247 N202 MEM_YAKOPCIC  ; pins TE BE XSV
X§X7_10N IL10 P248 N218 MEM_YAKOPCIC  ; pins TE BE XSV
X§X7_11P IL11 P252 N203 MEM_YAKOPCIC  ; pins TE BE XSV
X§X7_11N IL11 P249 N219 MEM_YAKOPCIC  ; pins TE BE XSV
X§X7_12P IL12 P258 N204 MEM_YAKOPCIC  ; pins TE BE XSV
X§X7_12N IL12 P250 N220 MEM_YAKOPCIC  ; pins TE BE XSV
X§X9_10P IL10 P259 N266 MEM_YAKOPCIC  ; pins TE BE XSV
X§X9_10N IL10 P260 N282 MEM_YAKOPCIC  ; pins TE BE XSV
X§X9_11P IL11 P261 N267 MEM_YAKOPCIC  ; pins TE BE XSV
X§X9_11N IL11 P262 N283 MEM_YAKOPCIC  ; pins TE BE XSV
X§X9_12P IL12 P263 N268 MEM_YAKOPCIC  ; pins TE BE XSV
X§X9_12N IL12 P264 N284 MEM_YAKOPCIC  ; pins TE BE XSV
R8_10P N234 0 1G
R8_11P N235 0 1G
R8_12P N236 0 1G
R9_10P N266 0 1G
R9_11P N267 0 1G
R9_12P N268 0 1G
R9_12N N284 0 1G
R9_11N N283 0 1G
R9_10N N282 0 1G
R7_10P N202 0 1G tol=1 pwr=0.1
R7_11P N203 0 1G
R7_12P N204 0 1G
R7_10N N218 0 1G
R7_11N N219 0 1G
R7_12N N220 0 1G
R8_11N N251 0 1G
R8_12N N252 0 1G
R8_10N N250 0 1G
M7_13P P265 WL7P BL7P BL7P SWNMOS
M7_13N P266 WL7N BL7N BL7N SWNMOS
M7_14N P267 WL7N BL7N BL7N SWNMOS
M7_15N P268 WL7N BL7N BL7N SWNMOS
M8_13P P269 WL8P BL8P BL8P SWNMOS
M7_14P P270 WL7P BL7P BL7P SWNMOS
M8_13N P271 WL8N BL8N BL8N SWNMOS
M8_14P P272 WL8P BL8P BL8P SWNMOS
M8_14N P273 WL8N BL8N BL8N SWNMOS
M8_15P P274 WL8P BL8P BL8P SWNMOS
M8_15N P275 WL8N BL8N BL8N SWNMOS
M7_15P P276 WL7P BL7P BL7P SWNMOS
M9_13P P277 WL9P BL9P BL9P SWNMOS
M9_13N P278 WL9N BL9N BL9N SWNMOS
M9_14P P279 WL9P BL9P BL9P SWNMOS
M9_14N P280 WL9N BL9N BL9N SWNMOS
M9_15P P281 WL9P BL9P BL9P SWNMOS
M9_15N P282 WL9N BL9N BL9N SWNMOS
X§X8_13P IL13 P269 N237 MEM_YAKOPCIC  ; pins TE BE XSV
X§X8_13N IL13 P271 N253 MEM_YAKOPCIC  ; pins TE BE XSV
X§X8_14P IL14 P272 N238 MEM_YAKOPCIC  ; pins TE BE XSV
X§X8_14N IL14 P273 N254 MEM_YAKOPCIC  ; pins TE BE XSV
X§X8_15P IL15 P274 N239 MEM_YAKOPCIC  ; pins TE BE XSV
X§X8_15N IL15 P275 N255 MEM_YAKOPCIC  ; pins TE BE XSV
X§X7_13P IL13 P265 N205 MEM_YAKOPCIC  ; pins TE BE XSV
X§X7_13N IL13 P266 N221 MEM_YAKOPCIC  ; pins TE BE XSV
X§X7_14P IL14 P270 N206 MEM_YAKOPCIC  ; pins TE BE XSV
X§X7_14N IL14 P267 N222 MEM_YAKOPCIC  ; pins TE BE XSV
X§X7_15P IL15 P276 N207 MEM_YAKOPCIC  ; pins TE BE XSV
X§X7_15N IL15 P268 N223 MEM_YAKOPCIC  ; pins TE BE XSV
X§X9_13P IL13 P277 N269 MEM_YAKOPCIC  ; pins TE BE XSV
X§X9_13N IL13 P278 N285 MEM_YAKOPCIC  ; pins TE BE XSV
X§X9_14P IL14 P279 N270 MEM_YAKOPCIC  ; pins TE BE XSV
X§X9_14N IL14 P280 N286 MEM_YAKOPCIC  ; pins TE BE XSV
X§X9_15P IL15 P281 N271 MEM_YAKOPCIC  ; pins TE BE XSV
X§X9_15N IL15 P282 N287 MEM_YAKOPCIC  ; pins TE BE XSV
R8_13P N237 0 1G
R8_14P N238 0 1G
R8_15P N239 0 1G
R9_13P N269 0 1G
R9_14P N270 0 1G
R9_15P N271 0 1G
R9_15N N287 0 1G
R9_14N N286 0 1G
R9_13N N285 0 1G
R7_13P N205 0 1G tol=1 pwr=0.1
R7_14P N206 0 1G
R7_15P N207 0 1G
R7_13N N221 0 1G
R7_14N N222 0 1G
R7_15N N223 0 1G
R8_14N N254 0 1G
R8_15N N255 0 1G
R8_13N N253 0 1G
M7_16N P283 WL7N BL7N BL7N SWNMOS
M8_16P P284 WL8P BL8P BL8P SWNMOS
M8_16N P285 WL8N BL8N BL8N SWNMOS
M7_16P P286 WL7P BL7P BL7P SWNMOS
M9_16P P287 WL9P BL9P BL9P SWNMOS
M9_16N P288 WL9N BL9N BL9N SWNMOS
X§X8_16P IL16 P284 N240 MEM_YAKOPCIC  ; pins TE BE XSV
X§X8_16N IL16 P285 N256 MEM_YAKOPCIC  ; pins TE BE XSV
X§X7_16P IL16 P286 N208 MEM_YAKOPCIC  ; pins TE BE XSV
X§X7_16N IL16 P283 N224 MEM_YAKOPCIC  ; pins TE BE XSV
X§X9_16P IL16 P287 N272 MEM_YAKOPCIC  ; pins TE BE XSV
X§X9_16N IL16 P288 N288 MEM_YAKOPCIC  ; pins TE BE XSV
R8_16P N240 0 1G
R9_16P N272 0 1G
R9_16N N288 0 1G
R7_16P N208 0 1G
R7_16N N224 0 1G
R8_16N N256 0 1G
M10_1P P289 WL10P BL10P BL10P SWNMOS
M10_1N P290 WL10N BL10N BL10N SWNMOS
M10_2N P291 WL10N BL10N BL10N SWNMOS
M10_3N P292 WL10N BL10N BL10N SWNMOS
M11_1P P293 WL11P BL11P BL11P SWNMOS
M10_2P P294 WL10P BL10P BL10P SWNMOS
M11_1N P295 WL11N BL11N BL11N SWNMOS
M11_2P P296 WL11P BL11P BL11P SWNMOS
M11_2N P297 WL11N BL11N BL11N SWNMOS
M11_3P P298 WL11P BL11P BL11P SWNMOS
M11_3N P299 WL11N BL11N BL11N SWNMOS
M10_3P P300 WL10P BL10P BL10P SWNMOS
M12_1P P301 WL12P BL12P BL12P SWNMOS
M12_1N P302 WL12N BL12N BL12N SWNMOS
M12_2P P303 WL12P BL12P BL12P SWNMOS
M12_2N P304 WL12N BL12N BL12N SWNMOS
M12_3P P305 WL12P BL12P BL12P SWNMOS
M12_3N P306 WL12N BL12N BL12N SWNMOS
X§X11_1P IL1 P293 N321 MEM_YAKOPCIC  ; pins TE BE XSV
X§X11_1N IL1 P295 N337 MEM_YAKOPCIC  ; pins TE BE XSV
X§X11_2P IL2 P296 N322 MEM_YAKOPCIC  ; pins TE BE XSV
X§X11_2N IL2 P297 N338 MEM_YAKOPCIC  ; pins TE BE XSV
X§X11_3P IL3 P298 N323 MEM_YAKOPCIC  ; pins TE BE XSV
X§X11_3N IL3 P299 N339 MEM_YAKOPCIC  ; pins TE BE XSV
X§X10_1P IL1 P289 N289 MEM_YAKOPCIC  ; pins TE BE XSV
X§X10_1N IL1 P290 N305 MEM_YAKOPCIC  ; pins TE BE XSV
X§X10_2P IL2 P294 N290 MEM_YAKOPCIC  ; pins TE BE XSV
X§X10_2N IL2 P291 N306 MEM_YAKOPCIC  ; pins TE BE XSV
X§X10_3P IL3 P300 N291 MEM_YAKOPCIC  ; pins TE BE XSV
X§X10_3N IL3 P292 N307 MEM_YAKOPCIC  ; pins TE BE XSV
X§X12_1P IL1 P301 N353 MEM_YAKOPCIC  ; pins TE BE XSV
X§X12_1N IL1 P302 N369 MEM_YAKOPCIC  ; pins TE BE XSV
X§X12_2P IL2 P303 N354 MEM_YAKOPCIC  ; pins TE BE XSV
X§X12_2N IL2 P304 N370 MEM_YAKOPCIC  ; pins TE BE XSV
X§X12_3P IL3 P305 N355 MEM_YAKOPCIC  ; pins TE BE XSV
X§X12_3N IL3 P306 N371 MEM_YAKOPCIC  ; pins TE BE XSV
R11_1P N321 0 1G
R11_2P N322 0 1G
R11_3P N323 0 1G
R12_1P N353 0 1G
R12_2P N354 0 1G
R12_3P N355 0 1G
R12_3N N371 0 1G
R12_2N N370 0 1G
R12_1N N369 0 1G
R10_1P N289 0 1G tol=1 pwr=0.1
R10_2P N290 0 1G
R10_3P N291 0 1G
R10_1N N305 0 1G
R10_2N N306 0 1G
R10_3N N307 0 1G
R11_2N N338 0 1G
R11_3N N339 0 1G
R11_1N N337 0 1G
M10_4P P307 WL10P BL10P BL10P SWNMOS
M10_4N P308 WL10N BL10N BL10N SWNMOS
M10_5N P309 WL10N BL10N BL10N SWNMOS
M10_6N P310 WL10N BL10N BL10N SWNMOS
M11_4P P311 WL11P BL11P BL11P SWNMOS
M10_5P P312 WL10P BL10P BL10P SWNMOS
M11_4N P313 WL11N BL11N BL11N SWNMOS
M11_5P P314 WL11P BL11P BL11P SWNMOS
M11_5N P315 WL11N BL11N BL11N SWNMOS
M11_6P P316 WL11P BL11P BL11P SWNMOS
M11_6N P317 WL11N BL11N BL11N SWNMOS
M10_6P P318 WL10P BL10P BL10P SWNMOS
M12_4P P319 WL12P BL12P BL12P SWNMOS
M12_4N P320 WL12N BL12N BL12N SWNMOS
M12_5P P321 WL12P BL12P BL12P SWNMOS
M12_5N P322 WL12N BL12N BL12N SWNMOS
M12_6P P323 WL12P BL12P BL12P SWNMOS
M12_6N P324 WL12N BL12N BL12N SWNMOS
X§X11_4P IL4 P311 N324 MEM_YAKOPCIC  ; pins TE BE XSV
X§X11_4N IL4 P313 N340 MEM_YAKOPCIC  ; pins TE BE XSV
X§X11_5P IL5 P314 N325 MEM_YAKOPCIC  ; pins TE BE XSV
X§X11_5N IL5 P315 N341 MEM_YAKOPCIC  ; pins TE BE XSV
X§X11_6P IL6 P316 N326 MEM_YAKOPCIC  ; pins TE BE XSV
X§X11_6N IL6 P317 N342 MEM_YAKOPCIC  ; pins TE BE XSV
X§X10_4P IL4 P307 N292 MEM_YAKOPCIC  ; pins TE BE XSV
X§X10_4N IL4 P308 N308 MEM_YAKOPCIC  ; pins TE BE XSV
X§X10_5P IL5 P312 N293 MEM_YAKOPCIC  ; pins TE BE XSV
X§X10_5N IL5 P309 N309 MEM_YAKOPCIC  ; pins TE BE XSV
X§X10_6P IL6 P318 N294 MEM_YAKOPCIC  ; pins TE BE XSV
X§X10_6N IL6 P310 N310 MEM_YAKOPCIC  ; pins TE BE XSV
X§X12_4P IL4 P319 N356 MEM_YAKOPCIC  ; pins TE BE XSV
X§X12_4N IL4 P320 N372 MEM_YAKOPCIC  ; pins TE BE XSV
X§X12_5P IL5 P321 N357 MEM_YAKOPCIC  ; pins TE BE XSV
X§X12_5N IL5 P322 N373 MEM_YAKOPCIC  ; pins TE BE XSV
X§X12_6P IL6 P323 N358 MEM_YAKOPCIC  ; pins TE BE XSV
X§X12_6N IL6 P324 N374 MEM_YAKOPCIC  ; pins TE BE XSV
R11_4P N324 0 1G
R11_5P N325 0 1G
R11_6P N326 0 1G
R12_4P N356 0 1G
R12_5P N357 0 1G
R12_6P N358 0 1G
R12_6N N374 0 1G
R12_5N N373 0 1G
R12_4N N372 0 1G
R10_4P N292 0 1G tol=1 pwr=0.1
R10_5P N293 0 1G
R10_6P N294 0 1G
R10_4N N308 0 1G
R10_5N N309 0 1G
R10_6N N310 0 1G
R11_5N N341 0 1G
R11_6N N342 0 1G
R11_4N N340 0 1G
M10_7P P325 WL10P BL10P BL10P SWNMOS
M10_7N P326 WL10N BL10N BL10N SWNMOS
M10_8N P327 WL10N BL10N BL10N SWNMOS
M10_9N P328 WL10N BL10N BL10N SWNMOS
M11_7P P329 WL11P BL11P BL11P SWNMOS
M10_8P P330 WL10P BL10P BL10P SWNMOS
M11_7N P331 WL11N BL11N BL11N SWNMOS
M11_8P P332 WL11P BL11P BL11P SWNMOS
M11_8N P333 WL11N BL11N BL11N SWNMOS
M11_9P P334 WL11P BL11P BL11P SWNMOS
M11_9N P335 WL11N BL11N BL11N SWNMOS
M10_9P P336 WL10P BL10P BL10P SWNMOS
M12_7P P337 WL12P BL12P BL12P SWNMOS
M12_7N P338 WL12N BL12N BL12N SWNMOS
M12_8P P339 WL12P BL12P BL12P SWNMOS
M12_8N P340 WL12N BL12N BL12N SWNMOS
M12_9P P341 WL12P BL12P BL12P SWNMOS
M12_9N P342 WL12N BL12N BL12N SWNMOS
X§X11_7P IL7 P329 N327 MEM_YAKOPCIC  ; pins TE BE XSV
X§X11_7N IL7 P331 N343 MEM_YAKOPCIC  ; pins TE BE XSV
X§X11_8P IL8 P332 N328 MEM_YAKOPCIC  ; pins TE BE XSV
X§X11_8N IL8 P333 N344 MEM_YAKOPCIC  ; pins TE BE XSV
X§X11_9P IL9 P334 N329 MEM_YAKOPCIC  ; pins TE BE XSV
X§X11_9N IL9 P335 N345 MEM_YAKOPCIC  ; pins TE BE XSV
X§X10_7P IL7 P325 N295 MEM_YAKOPCIC  ; pins TE BE XSV
X§X10_7N IL7 P326 N311 MEM_YAKOPCIC  ; pins TE BE XSV
X§X10_8P IL8 P330 N296 MEM_YAKOPCIC  ; pins TE BE XSV
X§X10_8N IL8 P327 N312 MEM_YAKOPCIC  ; pins TE BE XSV
X§X10_9P IL9 P336 N297 MEM_YAKOPCIC  ; pins TE BE XSV
X§X10_9N IL9 P328 N313 MEM_YAKOPCIC  ; pins TE BE XSV
X§X12_7P IL7 P337 N359 MEM_YAKOPCIC  ; pins TE BE XSV
X§X12_7N IL7 P338 N375 MEM_YAKOPCIC  ; pins TE BE XSV
X§X12_8P IL8 P339 N360 MEM_YAKOPCIC  ; pins TE BE XSV
X§X12_8N IL8 P340 N376 MEM_YAKOPCIC  ; pins TE BE XSV
X§X12_9P IL9 P341 N361 MEM_YAKOPCIC  ; pins TE BE XSV
X§X12_9N IL9 P342 N377 MEM_YAKOPCIC  ; pins TE BE XSV
R11_7P N327 0 1G
R11_8P N328 0 1G
R11_9P N329 0 1G
R12_7P N359 0 1G
R12_8P N360 0 1G
R12_9P N361 0 1G
R12_9N N377 0 1G
R12_8N N376 0 1G
R12_7N N375 0 1G
R10_7P N295 0 1G tol=1 pwr=0.1
R10_8P N296 0 1G
R10_9P N297 0 1G
R10_7N N311 0 1G
R10_8N N312 0 1G
R10_9N N313 0 1G
R11_8N N344 0 1G
R11_9N N345 0 1G
R11_7N N343 0 1G
M10_10P P343 WL10P BL10P BL10P SWNMOS
M10_10N P344 WL10N BL10N BL10N SWNMOS
M10_11N P345 WL10N BL10N BL10N SWNMOS
M10_12N P346 WL10N BL10N BL10N SWNMOS
M11_10P P347 WL11P BL11P BL11P SWNMOS
M10_11P P348 WL10P BL10P BL10P SWNMOS
M11_10N P349 WL11N BL11N BL11N SWNMOS
M11_11P P350 WL11P BL11P BL11P SWNMOS
M11_11N P351 WL11N BL11N BL11N SWNMOS
M11_12P P352 WL11P BL11P BL11P SWNMOS
M11_12N P353 WL11N BL11N BL11N SWNMOS
M10_12P P354 WL10P BL10P BL10P SWNMOS
M12_10P P355 WL12P BL12P BL12P SWNMOS
M12_10N P356 WL12N BL12N BL12N SWNMOS
M12_11P P357 WL12P BL12P BL12P SWNMOS
M12_11N P358 WL12N BL12N BL12N SWNMOS
M12_12P P359 WL12P BL12P BL12P SWNMOS
M12_12N P360 WL12N BL12N BL12N SWNMOS
X§X11_10P IL10 P347 N330 MEM_YAKOPCIC  ; pins TE BE XSV
X§X11_10N IL10 P349 N346 MEM_YAKOPCIC  ; pins TE BE XSV
X§X11_11P IL11 P350 N331 MEM_YAKOPCIC  ; pins TE BE XSV
X§X11_11N IL11 P351 N347 MEM_YAKOPCIC  ; pins TE BE XSV
X§X11_12P IL12 P352 N332 MEM_YAKOPCIC  ; pins TE BE XSV
X§X11_12N IL12 P353 N348 MEM_YAKOPCIC  ; pins TE BE XSV
X§X10_10P IL10 P343 N298 MEM_YAKOPCIC  ; pins TE BE XSV
X§X10_10N IL10 P344 N314 MEM_YAKOPCIC  ; pins TE BE XSV
X§X10_11P IL11 P348 N299 MEM_YAKOPCIC  ; pins TE BE XSV
X§X10_11N IL11 P345 N315 MEM_YAKOPCIC  ; pins TE BE XSV
X§X10_12P IL12 P354 N300 MEM_YAKOPCIC  ; pins TE BE XSV
X§X10_12N IL12 P346 N316 MEM_YAKOPCIC  ; pins TE BE XSV
X§X12_10P IL10 P355 N362 MEM_YAKOPCIC  ; pins TE BE XSV
X§X12_10N IL10 P356 N378 MEM_YAKOPCIC  ; pins TE BE XSV
X§X12_11P IL11 P357 N363 MEM_YAKOPCIC  ; pins TE BE XSV
X§X12_11N IL11 P358 N379 MEM_YAKOPCIC  ; pins TE BE XSV
X§X12_12P IL12 P359 N364 MEM_YAKOPCIC  ; pins TE BE XSV
X§X12_12N IL12 P360 N380 MEM_YAKOPCIC  ; pins TE BE XSV
R11_10P N330 0 1G
R11_11P N331 0 1G
R11_12P N332 0 1G
R12_10P N362 0 1G
R12_11P N363 0 1G
R12_12P N364 0 1G
R12_12N N380 0 1G
R12_11N N379 0 1G
R12_10N N378 0 1G
R10_10P N298 0 1G tol=1 pwr=0.1
R10_11P N299 0 1G
R10_12P N300 0 1G
R10_10N N314 0 1G
R10_11N N315 0 1G
R10_12N N316 0 1G
R11_11N N347 0 1G
R11_12N N348 0 1G
R11_10N N346 0 1G
M10_13P P361 WL10P BL10P BL10P SWNMOS
M10_13N P362 WL10N BL10N BL10N SWNMOS
M10_14N P363 WL10N BL10N BL10N SWNMOS
M10_15N P364 WL10N BL10N BL10N SWNMOS
M11_13P P365 WL11P BL11P BL11P SWNMOS
M10_14P P366 WL10P BL10P BL10P SWNMOS
M11_13N P367 WL11N BL11N BL11N SWNMOS
M11_14P P368 WL11P BL11P BL11P SWNMOS
M11_14N P369 WL11N BL11N BL11N SWNMOS
M11_15P P370 WL11P BL11P BL11P SWNMOS
M11_15N P371 WL11N BL11N BL11N SWNMOS
M10_15P P372 WL10P BL10P BL10P SWNMOS
M12_13P P373 WL12P BL12P BL12P SWNMOS
M12_13N P374 WL12N BL12N BL12N SWNMOS
M12_14P P375 WL12P BL12P BL12P SWNMOS
M12_14N P376 WL12N BL12N BL12N SWNMOS
M12_15P P377 WL12P BL12P BL12P SWNMOS
M12_15N P378 WL12N BL12N BL12N SWNMOS
X§X11_13P IL13 P365 N333 MEM_YAKOPCIC  ; pins TE BE XSV
X§X11_13N IL13 P367 N349 MEM_YAKOPCIC  ; pins TE BE XSV
X§X11_14P IL14 P368 N334 MEM_YAKOPCIC  ; pins TE BE XSV
X§X11_14N IL14 P369 N350 MEM_YAKOPCIC  ; pins TE BE XSV
X§X11_15P IL15 P370 N335 MEM_YAKOPCIC  ; pins TE BE XSV
X§X11_15N IL15 P371 N351 MEM_YAKOPCIC  ; pins TE BE XSV
X§X10_13P IL13 P361 N301 MEM_YAKOPCIC  ; pins TE BE XSV
X§X10_13N IL13 P362 N317 MEM_YAKOPCIC  ; pins TE BE XSV
X§X10_14P IL14 P366 N302 MEM_YAKOPCIC  ; pins TE BE XSV
X§X10_14N IL14 P363 N318 MEM_YAKOPCIC  ; pins TE BE XSV
X§X10_15P IL15 P372 N303 MEM_YAKOPCIC  ; pins TE BE XSV
X§X10_15N IL15 P364 N319 MEM_YAKOPCIC  ; pins TE BE XSV
X§X12_13P IL13 P373 N365 MEM_YAKOPCIC  ; pins TE BE XSV
X§X12_13N IL13 P374 N381 MEM_YAKOPCIC  ; pins TE BE XSV
X§X12_14P IL14 P375 N366 MEM_YAKOPCIC  ; pins TE BE XSV
X§X12_14N IL14 P376 N382 MEM_YAKOPCIC  ; pins TE BE XSV
X§X12_15P IL15 P377 N367 MEM_YAKOPCIC  ; pins TE BE XSV
X§X12_15N IL15 P378 N383 MEM_YAKOPCIC  ; pins TE BE XSV
R11_13P N333 0 1G
R11_14P N334 0 1G
R11_15P N335 0 1G
R12_13P N365 0 1G
R12_14P N366 0 1G
R12_15P N367 0 1G
R12_15N N383 0 1G
R12_14N N382 0 1G
R12_13N N381 0 1G
R10_13P N301 0 1G tol=1 pwr=0.1
R10_14P N302 0 1G
R10_15P N303 0 1G
R10_13N N317 0 1G
R10_14N N318 0 1G
R10_15N N319 0 1G
R11_14N N350 0 1G
R11_15N N351 0 1G
R11_13N N349 0 1G
M10_16N P379 WL10N BL10N BL10N SWNMOS
M11_16P P380 WL11P BL11P BL11P SWNMOS
M11_16N P381 WL11N BL11N BL11N SWNMOS
M10_16P P382 WL10P BL10P BL10P SWNMOS
M12_16P P383 WL12P BL12P BL12P SWNMOS
M12_16N P384 WL12N BL12N BL12N SWNMOS
X§X11_16P IL16 P380 N336 MEM_YAKOPCIC  ; pins TE BE XSV
X§X11_16N IL16 P381 N352 MEM_YAKOPCIC  ; pins TE BE XSV
X§X10_16P IL16 P382 N304 MEM_YAKOPCIC  ; pins TE BE XSV
X§X10_16N IL16 P379 N320 MEM_YAKOPCIC  ; pins TE BE XSV
X§X12_16P IL16 P383 N368 MEM_YAKOPCIC  ; pins TE BE XSV
X§X12_16N IL16 P384 N384 MEM_YAKOPCIC  ; pins TE BE XSV
R11_16P N336 0 1G
R12_16P N368 0 1G
R12_16N N384 0 1G
R10_16P N304 0 1G
R10_16N N320 0 1G
R11_16N N352 0 1G
M13_1P P385 WL13P BL13P BL13P SWNMOS
M13_1N P386 WL13N BL13N BL13N SWNMOS
M13_2N P387 WL13N BL13N BL13N SWNMOS
M13_3N P388 WL13N BL13N BL13N SWNMOS
M14_1P P389 WL14P BL14P BL14P SWNMOS
M13_2P P390 WL13P BL13P BL13P SWNMOS
M14_1N P391 WL14N BL14N BL14N SWNMOS
M14_2P P392 WL14P BL14P BL14P SWNMOS
M14_2N P393 WL14N BL14N BL14N SWNMOS
M14_3P P394 WL14P BL14P BL14P SWNMOS
M14_3N P395 WL14N BL14N BL14N SWNMOS
M13_3P P396 WL13P BL13P BL13P SWNMOS
M15_1P P397 WL15P BL15P BL15P SWNMOS
M15_1N P398 WL15N BL15N BL15N SWNMOS
M15_2P P399 WL15P BL15P BL15P SWNMOS
M15_2N P400 WL15N BL15N BL15N SWNMOS
M15_3P P401 WL15P BL15P BL15P SWNMOS
M15_3N P402 WL15N BL15N BL15N SWNMOS
X§X14_1P IL1 P389 N417 MEM_YAKOPCIC  ; pins TE BE XSV
X§X14_1N IL1 P391 N433 MEM_YAKOPCIC  ; pins TE BE XSV
X§X14_2P IL2 P392 N418 MEM_YAKOPCIC  ; pins TE BE XSV
X§X14_2N IL2 P393 N434 MEM_YAKOPCIC  ; pins TE BE XSV
X§X14_3P IL3 P394 N419 MEM_YAKOPCIC  ; pins TE BE XSV
X§X14_3N IL3 P395 N435 MEM_YAKOPCIC  ; pins TE BE XSV
X§X13_1P IL1 P385 N385 MEM_YAKOPCIC  ; pins TE BE XSV
X§X13_1N IL1 P386 N401 MEM_YAKOPCIC  ; pins TE BE XSV
X§X13_2P IL2 P390 N386 MEM_YAKOPCIC  ; pins TE BE XSV
X§X13_2N IL2 P387 N402 MEM_YAKOPCIC  ; pins TE BE XSV
X§X13_3P IL3 P396 N387 MEM_YAKOPCIC  ; pins TE BE XSV
X§X13_3N IL3 P388 N403 MEM_YAKOPCIC  ; pins TE BE XSV
X§X15_1P IL1 P397 N449 MEM_YAKOPCIC  ; pins TE BE XSV
X§X15_1N IL1 P398 N465 MEM_YAKOPCIC  ; pins TE BE XSV
X§X15_2P IL2 P399 N450 MEM_YAKOPCIC  ; pins TE BE XSV
X§X15_2N IL2 P400 N466 MEM_YAKOPCIC  ; pins TE BE XSV
X§X15_3P IL3 P401 N451 MEM_YAKOPCIC  ; pins TE BE XSV
X§X15_3N IL3 P402 N467 MEM_YAKOPCIC  ; pins TE BE XSV
R14_1P N417 0 1G
R14_2P N418 0 1G
R14_3P N419 0 1G
R15_1P N449 0 1G
R15_2P N450 0 1G
R15_3P N451 0 1G
R15_3N N467 0 1G
R15_2N N466 0 1G
R15_1N N465 0 1G
R13_1P N385 0 1G tol=1 pwr=0.1
R13_2P N386 0 1G
R13_3P N387 0 1G
R13_1N N401 0 1G
R13_2N N402 0 1G
R13_3N N403 0 1G
R14_2N N434 0 1G
R14_3N N435 0 1G
R14_1N N433 0 1G
M13_4P P403 WL13P BL13P BL13P SWNMOS
M13_4N P404 WL13N BL13N BL13N SWNMOS
M13_5N P405 WL13N BL13N BL13N SWNMOS
M13_6N P406 WL13N BL13N BL13N SWNMOS
M14_4P P407 WL14P BL14P BL14P SWNMOS
M13_5P P408 WL13P BL13P BL13P SWNMOS
M14_4N P409 WL14N BL14N BL14N SWNMOS
M14_5P P410 WL14P BL14P BL14P SWNMOS
M14_5N P411 WL14N BL14N BL14N SWNMOS
M14_6P P412 WL14P BL14P BL14P SWNMOS
M14_6N P413 WL14N BL14N BL14N SWNMOS
M13_6P P414 WL13P BL13P BL13P SWNMOS
M15_4P P415 WL15P BL15P BL15P SWNMOS
M15_4N P416 WL15N BL15N BL15N SWNMOS
M15_5P P417 WL15P BL15P BL15P SWNMOS
M15_5N P418 WL15N BL15N BL15N SWNMOS
M15_6P P419 WL15P BL15P BL15P SWNMOS
M15_6N P420 WL15N BL15N BL15N SWNMOS
X§X14_4P IL4 P407 N420 MEM_YAKOPCIC  ; pins TE BE XSV
X§X14_4N IL4 P409 N436 MEM_YAKOPCIC  ; pins TE BE XSV
X§X14_5P IL5 P410 N421 MEM_YAKOPCIC  ; pins TE BE XSV
X§X14_5N IL5 P411 N437 MEM_YAKOPCIC  ; pins TE BE XSV
X§X14_6P IL6 P412 N422 MEM_YAKOPCIC  ; pins TE BE XSV
X§X14_6N IL6 P413 N438 MEM_YAKOPCIC  ; pins TE BE XSV
X§X13_4P IL4 P403 N388 MEM_YAKOPCIC  ; pins TE BE XSV
X§X13_4N IL4 P404 N404 MEM_YAKOPCIC  ; pins TE BE XSV
X§X13_5P IL5 P408 N389 MEM_YAKOPCIC  ; pins TE BE XSV
X§X13_5N IL5 P405 N405 MEM_YAKOPCIC  ; pins TE BE XSV
X§X13_6P IL6 P414 N390 MEM_YAKOPCIC  ; pins TE BE XSV
X§X13_6N IL6 P406 N406 MEM_YAKOPCIC  ; pins TE BE XSV
X§X15_4P IL4 P415 N452 MEM_YAKOPCIC  ; pins TE BE XSV
X§X15_4N IL4 P416 N468 MEM_YAKOPCIC  ; pins TE BE XSV
X§X15_5P IL5 P417 N453 MEM_YAKOPCIC  ; pins TE BE XSV
X§X15_5N IL5 P418 N469 MEM_YAKOPCIC  ; pins TE BE XSV
X§X15_6P IL6 P419 N454 MEM_YAKOPCIC  ; pins TE BE XSV
X§X15_6N IL6 P420 N470 MEM_YAKOPCIC  ; pins TE BE XSV
R14_4P N420 0 1G
R14_5P N421 0 1G
R14_6P N422 0 1G
R15_4P N452 0 1G
R15_5P N453 0 1G
R15_6P N454 0 1G
R15_6N N470 0 1G
R15_5N N469 0 1G
R15_4N N468 0 1G
R13_4P N388 0 1G tol=1 pwr=0.1
R13_5P N389 0 1G
R13_6P N390 0 1G
R13_4N N404 0 1G
R13_5N N405 0 1G
R13_6N N406 0 1G
R14_5N N437 0 1G
R14_6N N438 0 1G
R14_4N N436 0 1G
M13_7P P421 WL13P BL13P BL13P SWNMOS
M13_7N P422 WL13N BL13N BL13N SWNMOS
M13_8N P423 WL13N BL13N BL13N SWNMOS
M13_9N P424 WL13N BL13N BL13N SWNMOS
M14_7P P425 WL14P BL14P BL14P SWNMOS
M13_8P P426 WL13P BL13P BL13P SWNMOS
M14_7N P427 WL14N BL14N BL14N SWNMOS
M14_8P P428 WL14P BL14P BL14P SWNMOS
M14_8N P429 WL14N BL14N BL14N SWNMOS
M14_9P P430 WL14P BL14P BL14P SWNMOS
M14_9N P431 WL14N BL14N BL14N SWNMOS
M13_9P P432 WL13P BL13P BL13P SWNMOS
M15_7P P433 WL15P BL15P BL15P SWNMOS
M15_7N P434 WL15N BL15N BL15N SWNMOS
M15_8P P435 WL15P BL15P BL15P SWNMOS
M15_8N P436 WL15N BL15N BL15N SWNMOS
M15_9P P437 WL15P BL15P BL15P SWNMOS
M15_9N P438 WL15N BL15N BL15N SWNMOS
X§X14_7P IL7 P425 N423 MEM_YAKOPCIC  ; pins TE BE XSV
X§X14_7N IL7 P427 N439 MEM_YAKOPCIC  ; pins TE BE XSV
X§X14_8P IL8 P428 N424 MEM_YAKOPCIC  ; pins TE BE XSV
X§X14_8N IL8 P429 N440 MEM_YAKOPCIC  ; pins TE BE XSV
X§X14_9P IL9 P430 N425 MEM_YAKOPCIC  ; pins TE BE XSV
X§X14_9N IL9 P431 N441 MEM_YAKOPCIC  ; pins TE BE XSV
X§X13_7P IL7 P421 N391 MEM_YAKOPCIC  ; pins TE BE XSV
X§X13_7N IL7 P422 N407 MEM_YAKOPCIC  ; pins TE BE XSV
X§X13_8P IL8 P426 N392 MEM_YAKOPCIC  ; pins TE BE XSV
X§X13_8N IL8 P423 N408 MEM_YAKOPCIC  ; pins TE BE XSV
X§X13_9P IL9 P432 N393 MEM_YAKOPCIC  ; pins TE BE XSV
X§X13_9N IL9 P424 N409 MEM_YAKOPCIC  ; pins TE BE XSV
X§X15_7P IL7 P433 N455 MEM_YAKOPCIC  ; pins TE BE XSV
X§X15_7N IL7 P434 N471 MEM_YAKOPCIC  ; pins TE BE XSV
X§X15_8P IL8 P435 N456 MEM_YAKOPCIC  ; pins TE BE XSV
X§X15_8N IL8 P436 N472 MEM_YAKOPCIC  ; pins TE BE XSV
X§X15_9P IL9 P437 N457 MEM_YAKOPCIC  ; pins TE BE XSV
X§X15_9N IL9 P438 N473 MEM_YAKOPCIC  ; pins TE BE XSV
R14_7P N423 0 1G
R14_8P N424 0 1G
R14_9P N425 0 1G
R15_7P N455 0 1G
R15_8P N456 0 1G
R15_9P N457 0 1G
R15_9N N473 0 1G
R15_8N N472 0 1G
R15_7N N471 0 1G
R13_7P N391 0 1G tol=1 pwr=0.1
R13_8P N392 0 1G
R13_9P N393 0 1G
R13_7N N407 0 1G
R13_8N N408 0 1G
R13_9N N409 0 1G
R14_8N N440 0 1G
R14_9N N441 0 1G
R14_7N N439 0 1G
M13_10P P439 WL13P BL13P BL13P SWNMOS
M13_10N P440 WL13N BL13N BL13N SWNMOS
M13_11N P441 WL13N BL13N BL13N SWNMOS
M13_12N P442 WL13N BL13N BL13N SWNMOS
M14_10P P443 WL14P BL14P BL14P SWNMOS
M13_11P P444 WL13P BL13P BL13P SWNMOS
M14_10N P445 WL14N BL14N BL14N SWNMOS
M14_11P P446 WL14P BL14P BL14P SWNMOS
M14_11N P447 WL14N BL14N BL14N SWNMOS
M14_12P P448 WL14P BL14P BL14P SWNMOS
M14_12N P449 WL14N BL14N BL14N SWNMOS
M13_12P P450 WL13P BL13P BL13P SWNMOS
M15_10P P451 WL15P BL15P BL15P SWNMOS
M15_10N P452 WL15N BL15N BL15N SWNMOS
M15_11P P453 WL15P BL15P BL15P SWNMOS
M15_11N P454 WL15N BL15N BL15N SWNMOS
M15_12P P455 WL15P BL15P BL15P SWNMOS
M15_12N P456 WL15N BL15N BL15N SWNMOS
X§X14_10P IL10 P443 N426 MEM_YAKOPCIC  ; pins TE BE XSV
X§X14_10N IL10 P445 N442 MEM_YAKOPCIC  ; pins TE BE XSV
X§X14_11P IL11 P446 N427 MEM_YAKOPCIC  ; pins TE BE XSV
X§X14_11N IL11 P447 N443 MEM_YAKOPCIC  ; pins TE BE XSV
X§X14_12P IL12 P448 N428 MEM_YAKOPCIC  ; pins TE BE XSV
X§X14_12N IL12 P449 N444 MEM_YAKOPCIC  ; pins TE BE XSV
X§X13_10P IL10 P439 N394 MEM_YAKOPCIC  ; pins TE BE XSV
X§X13_10N IL10 P440 N410 MEM_YAKOPCIC  ; pins TE BE XSV
X§X13_11P IL11 P444 N395 MEM_YAKOPCIC  ; pins TE BE XSV
X§X13_11N IL11 P441 N411 MEM_YAKOPCIC  ; pins TE BE XSV
X§X13_12P IL12 P450 N396 MEM_YAKOPCIC  ; pins TE BE XSV
X§X13_12N IL12 P442 N412 MEM_YAKOPCIC  ; pins TE BE XSV
X§X15_10P IL10 P451 N458 MEM_YAKOPCIC  ; pins TE BE XSV
X§X15_10N IL10 P452 N474 MEM_YAKOPCIC  ; pins TE BE XSV
X§X15_11P IL11 P453 N459 MEM_YAKOPCIC  ; pins TE BE XSV
X§X15_11N IL11 P454 N475 MEM_YAKOPCIC  ; pins TE BE XSV
X§X15_12P IL12 P455 N460 MEM_YAKOPCIC  ; pins TE BE XSV
X§X15_12N IL12 P456 N476 MEM_YAKOPCIC  ; pins TE BE XSV
R14_10P N426 0 1G
R14_11P N427 0 1G
R14_12P N428 0 1G
R15_10P N458 0 1G
R15_11P N459 0 1G
R15_12P N460 0 1G
R15_12N N476 0 1G
R15_11N N475 0 1G
R15_10N N474 0 1G
R13_10P N394 0 1G tol=1 pwr=0.1
R13_11P N395 0 1G
R13_12P N396 0 1G
R13_10N N410 0 1G
R13_11N N411 0 1G
R13_12N N412 0 1G
R14_11N N443 0 1G
R14_12N N444 0 1G
R14_10N N442 0 1G